# Altium project adau1979-fpga.PrjPcb (part 1 of 6)
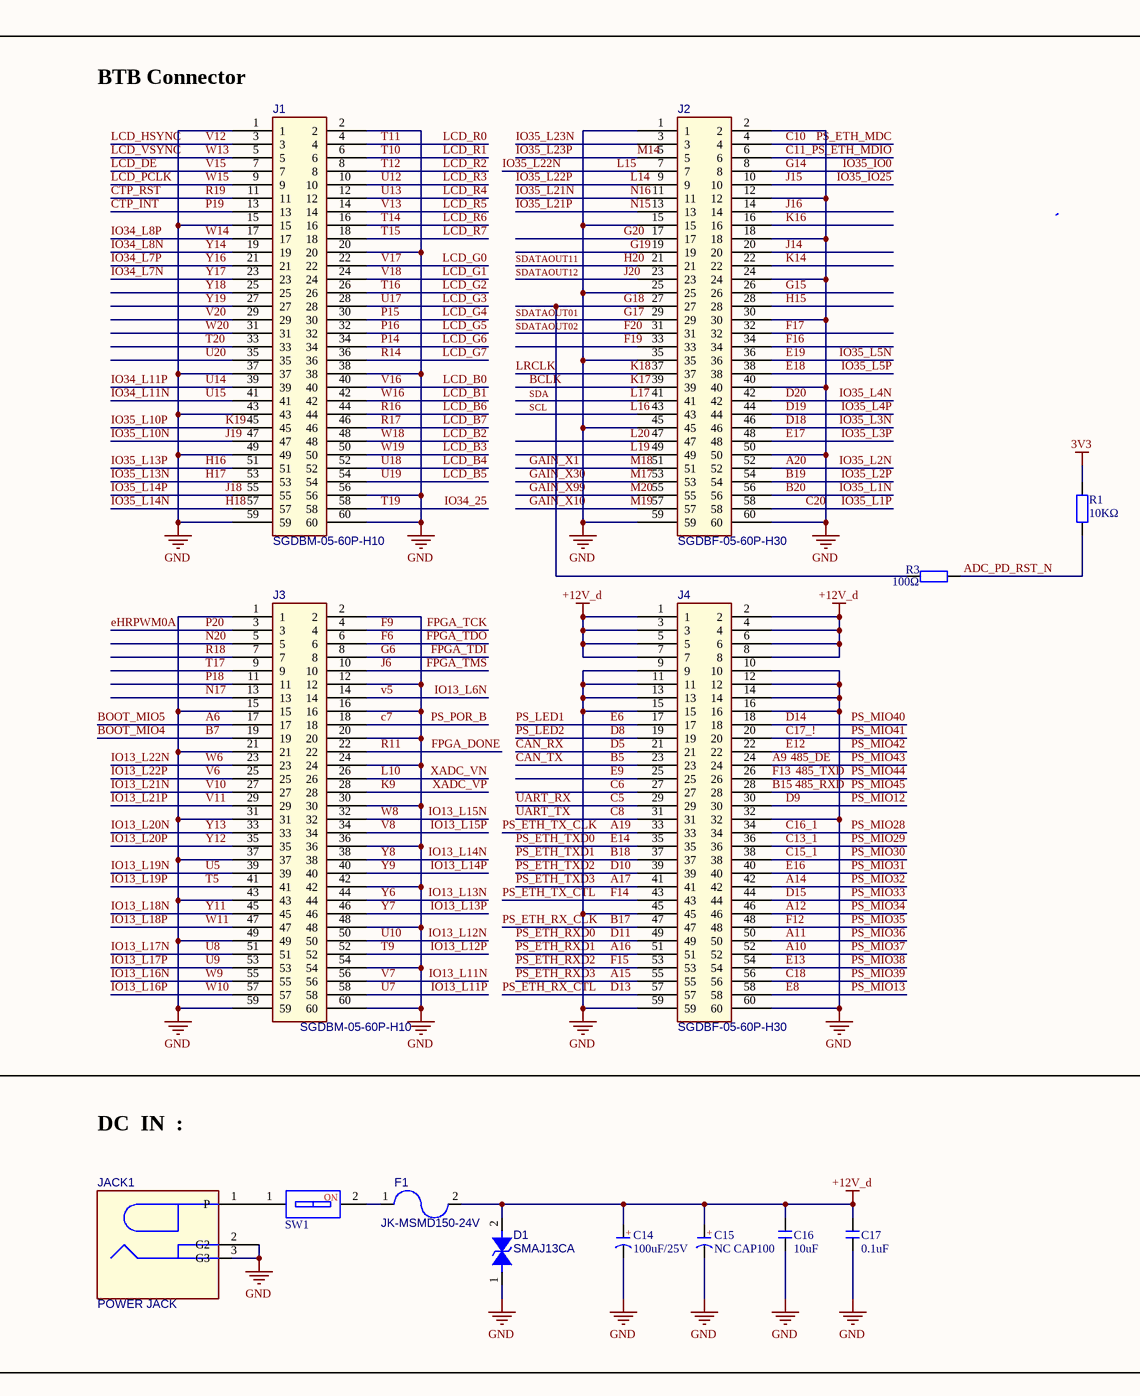
[diagram p0: adau1979_fpga.SchDoc, top left]
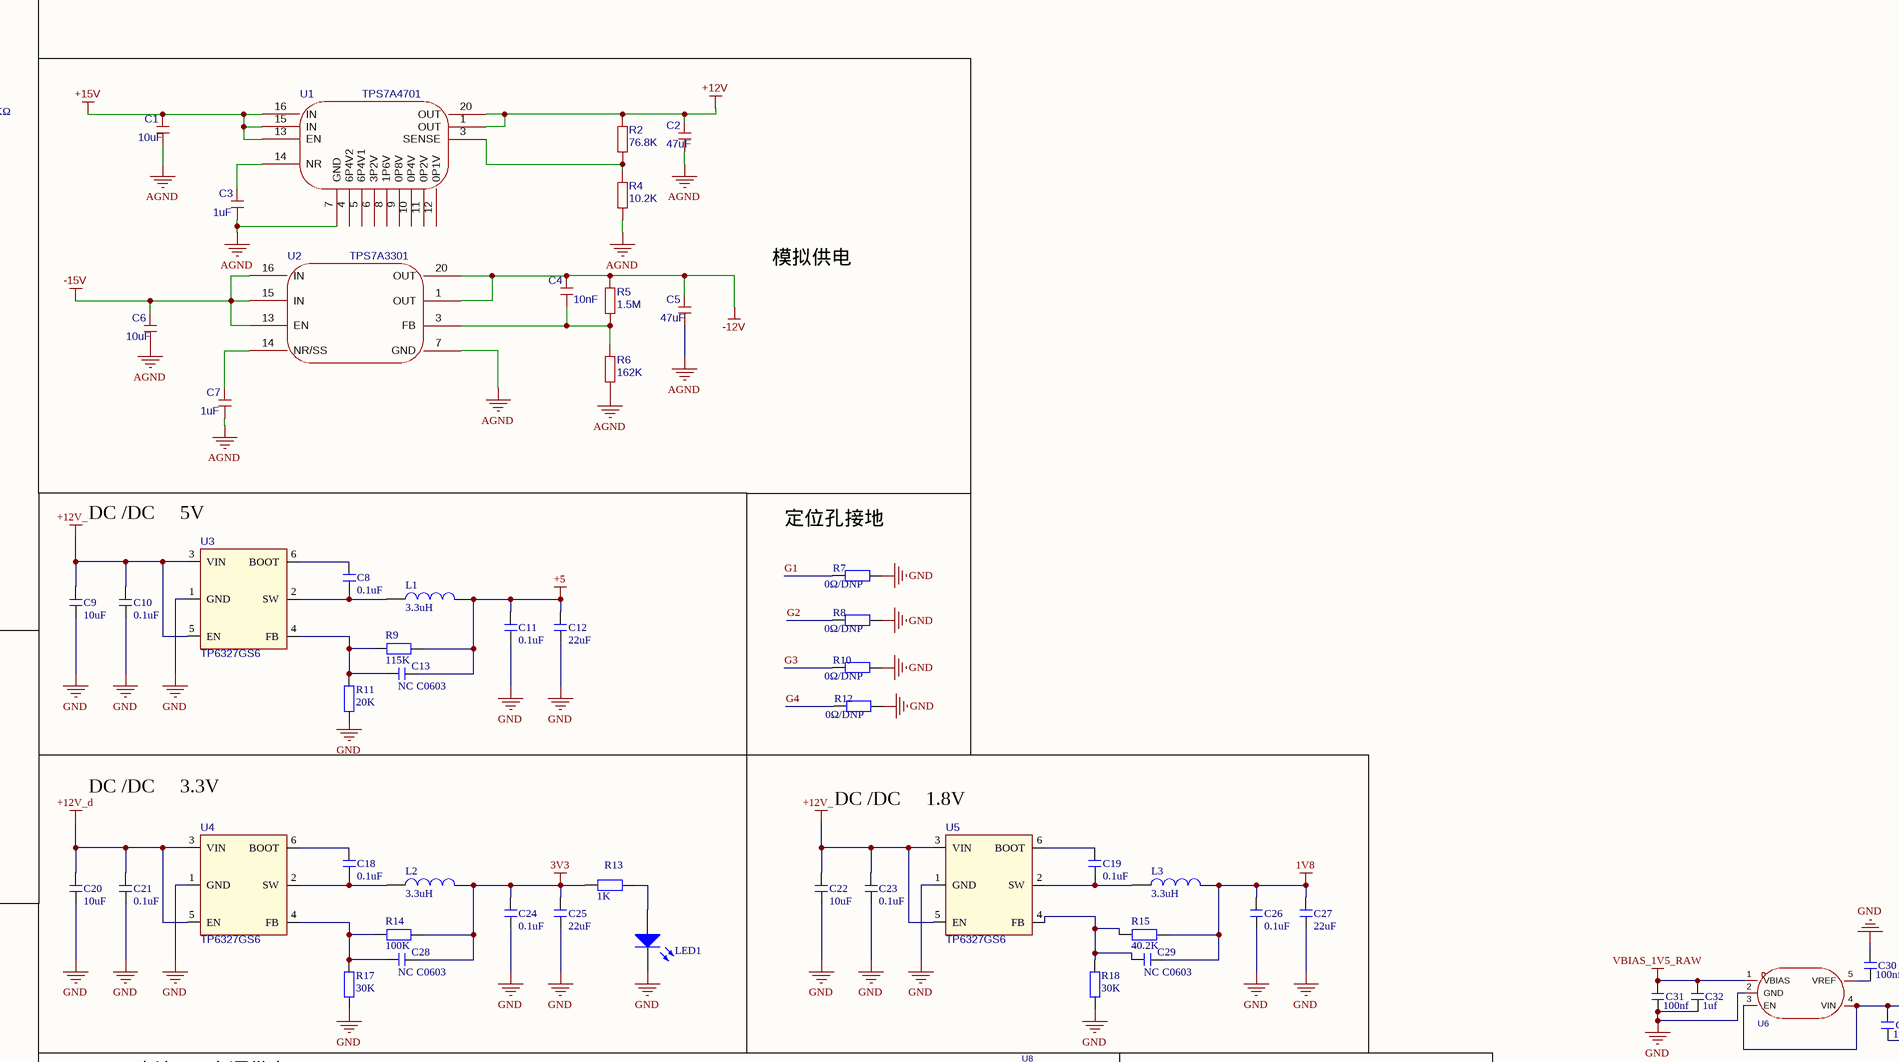
[diagram p1: adau1979_fpga.SchDoc, top middle]
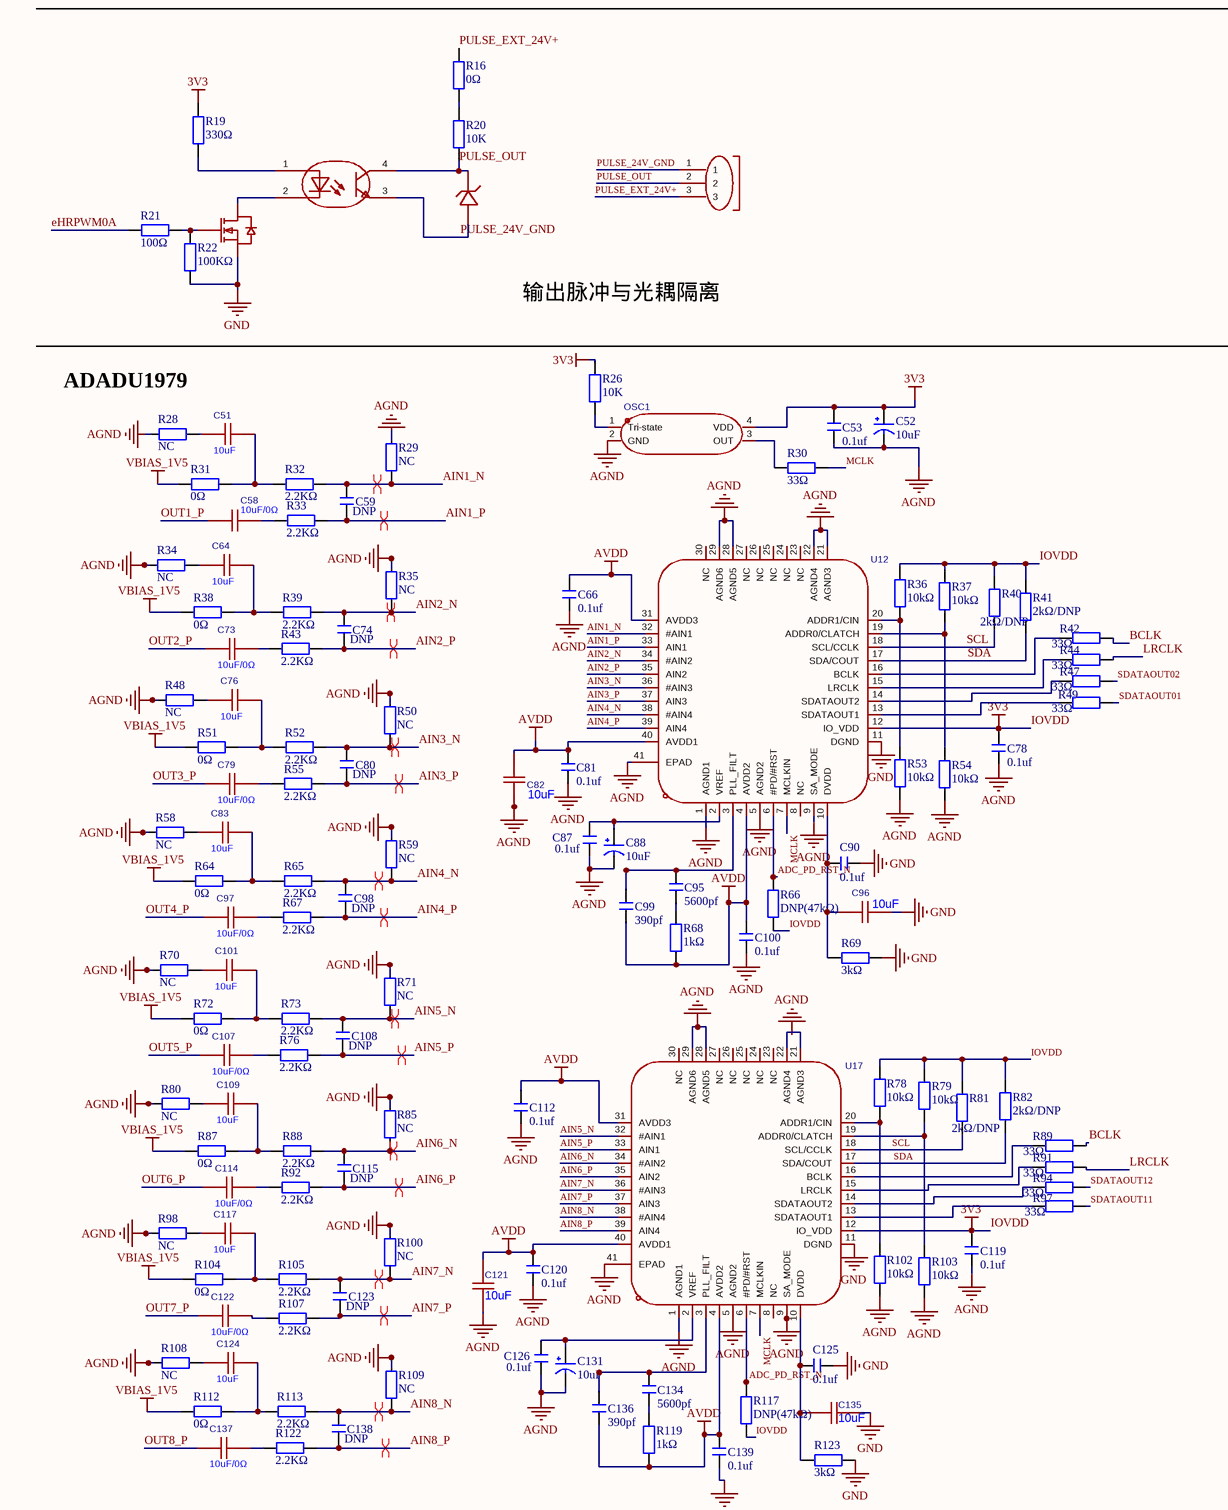
[diagram p2: adau1979_fpga.SchDoc, centre left]
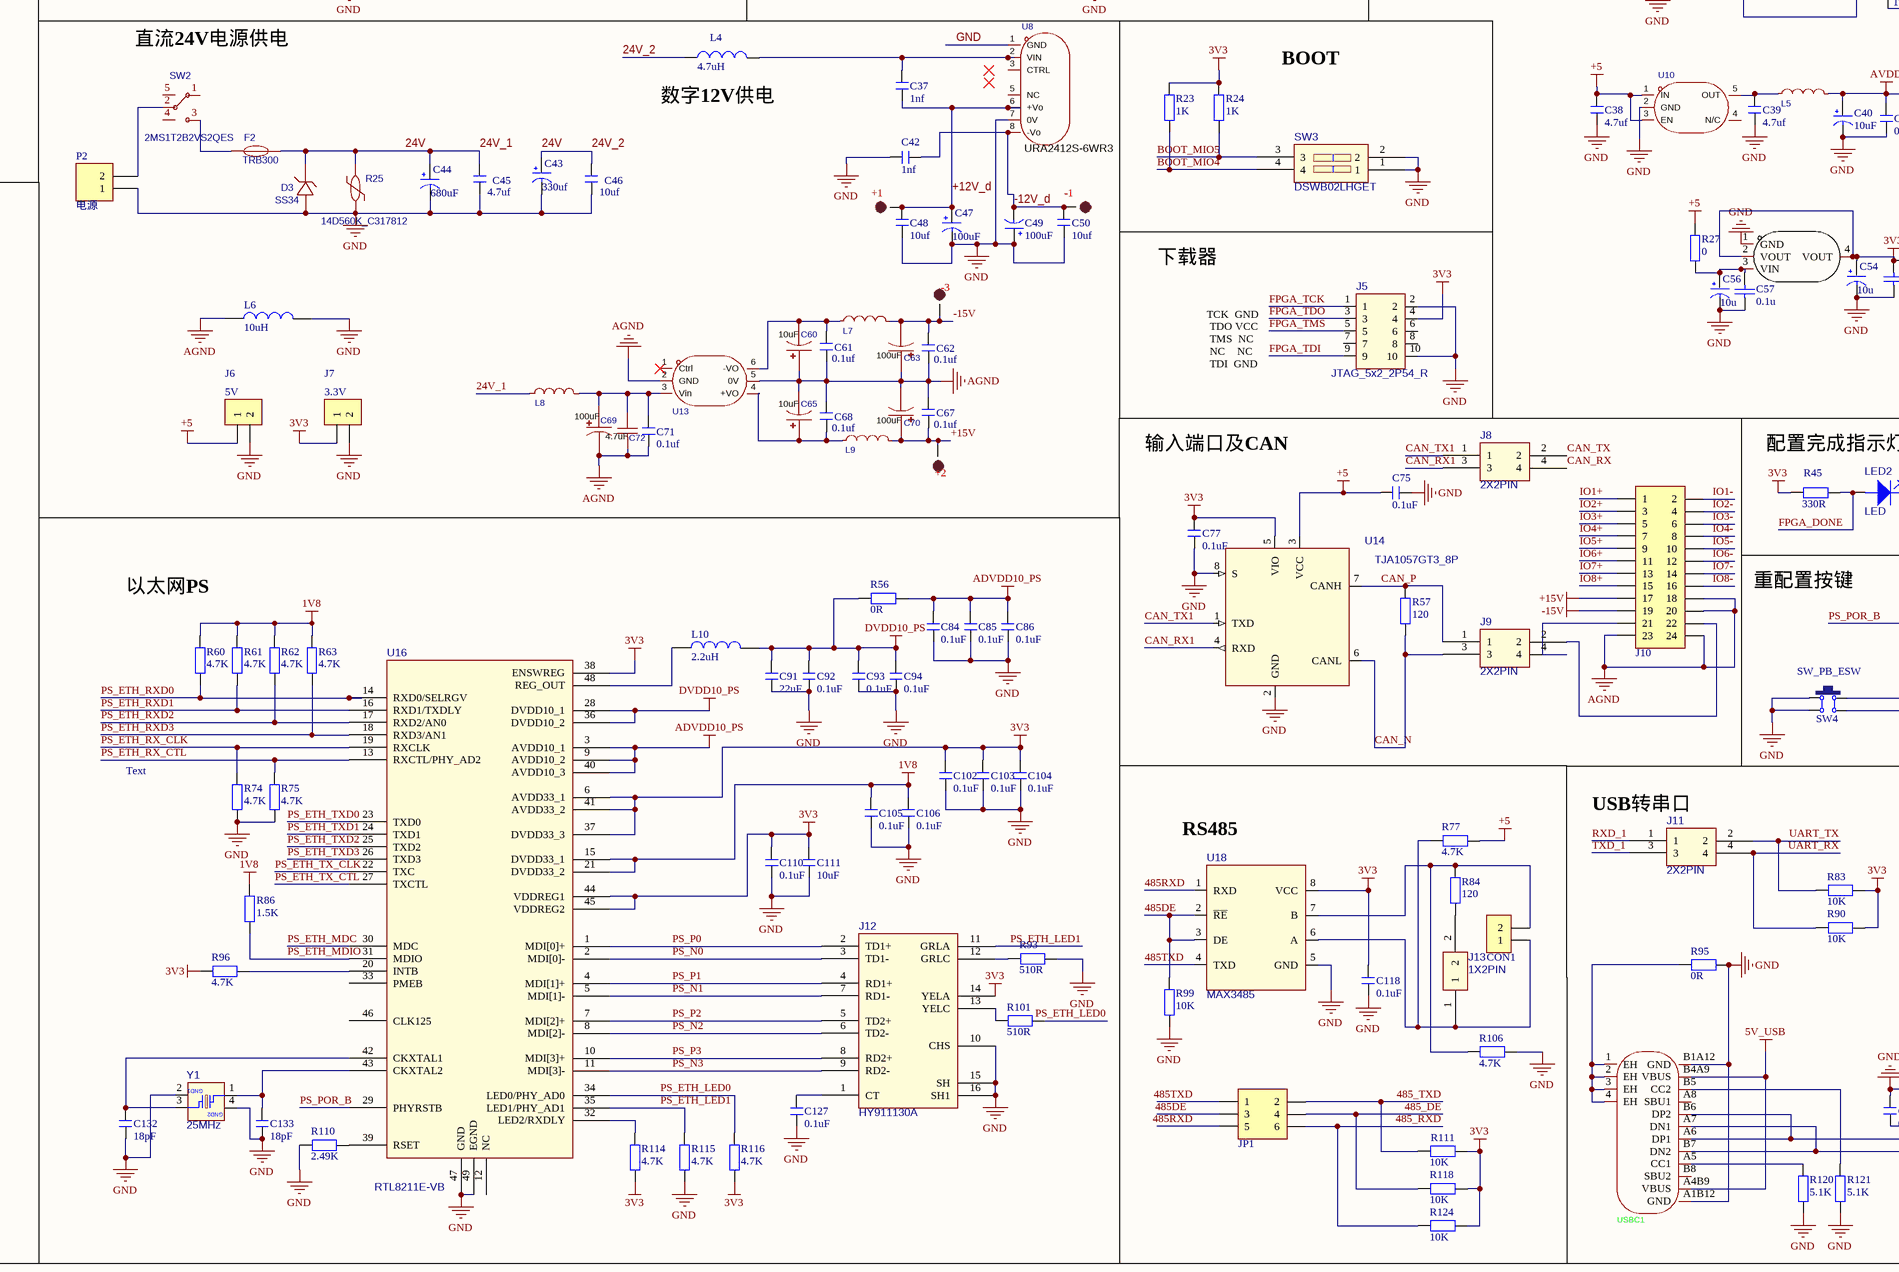
[diagram p3: adau1979_fpga.SchDoc, centre middle]
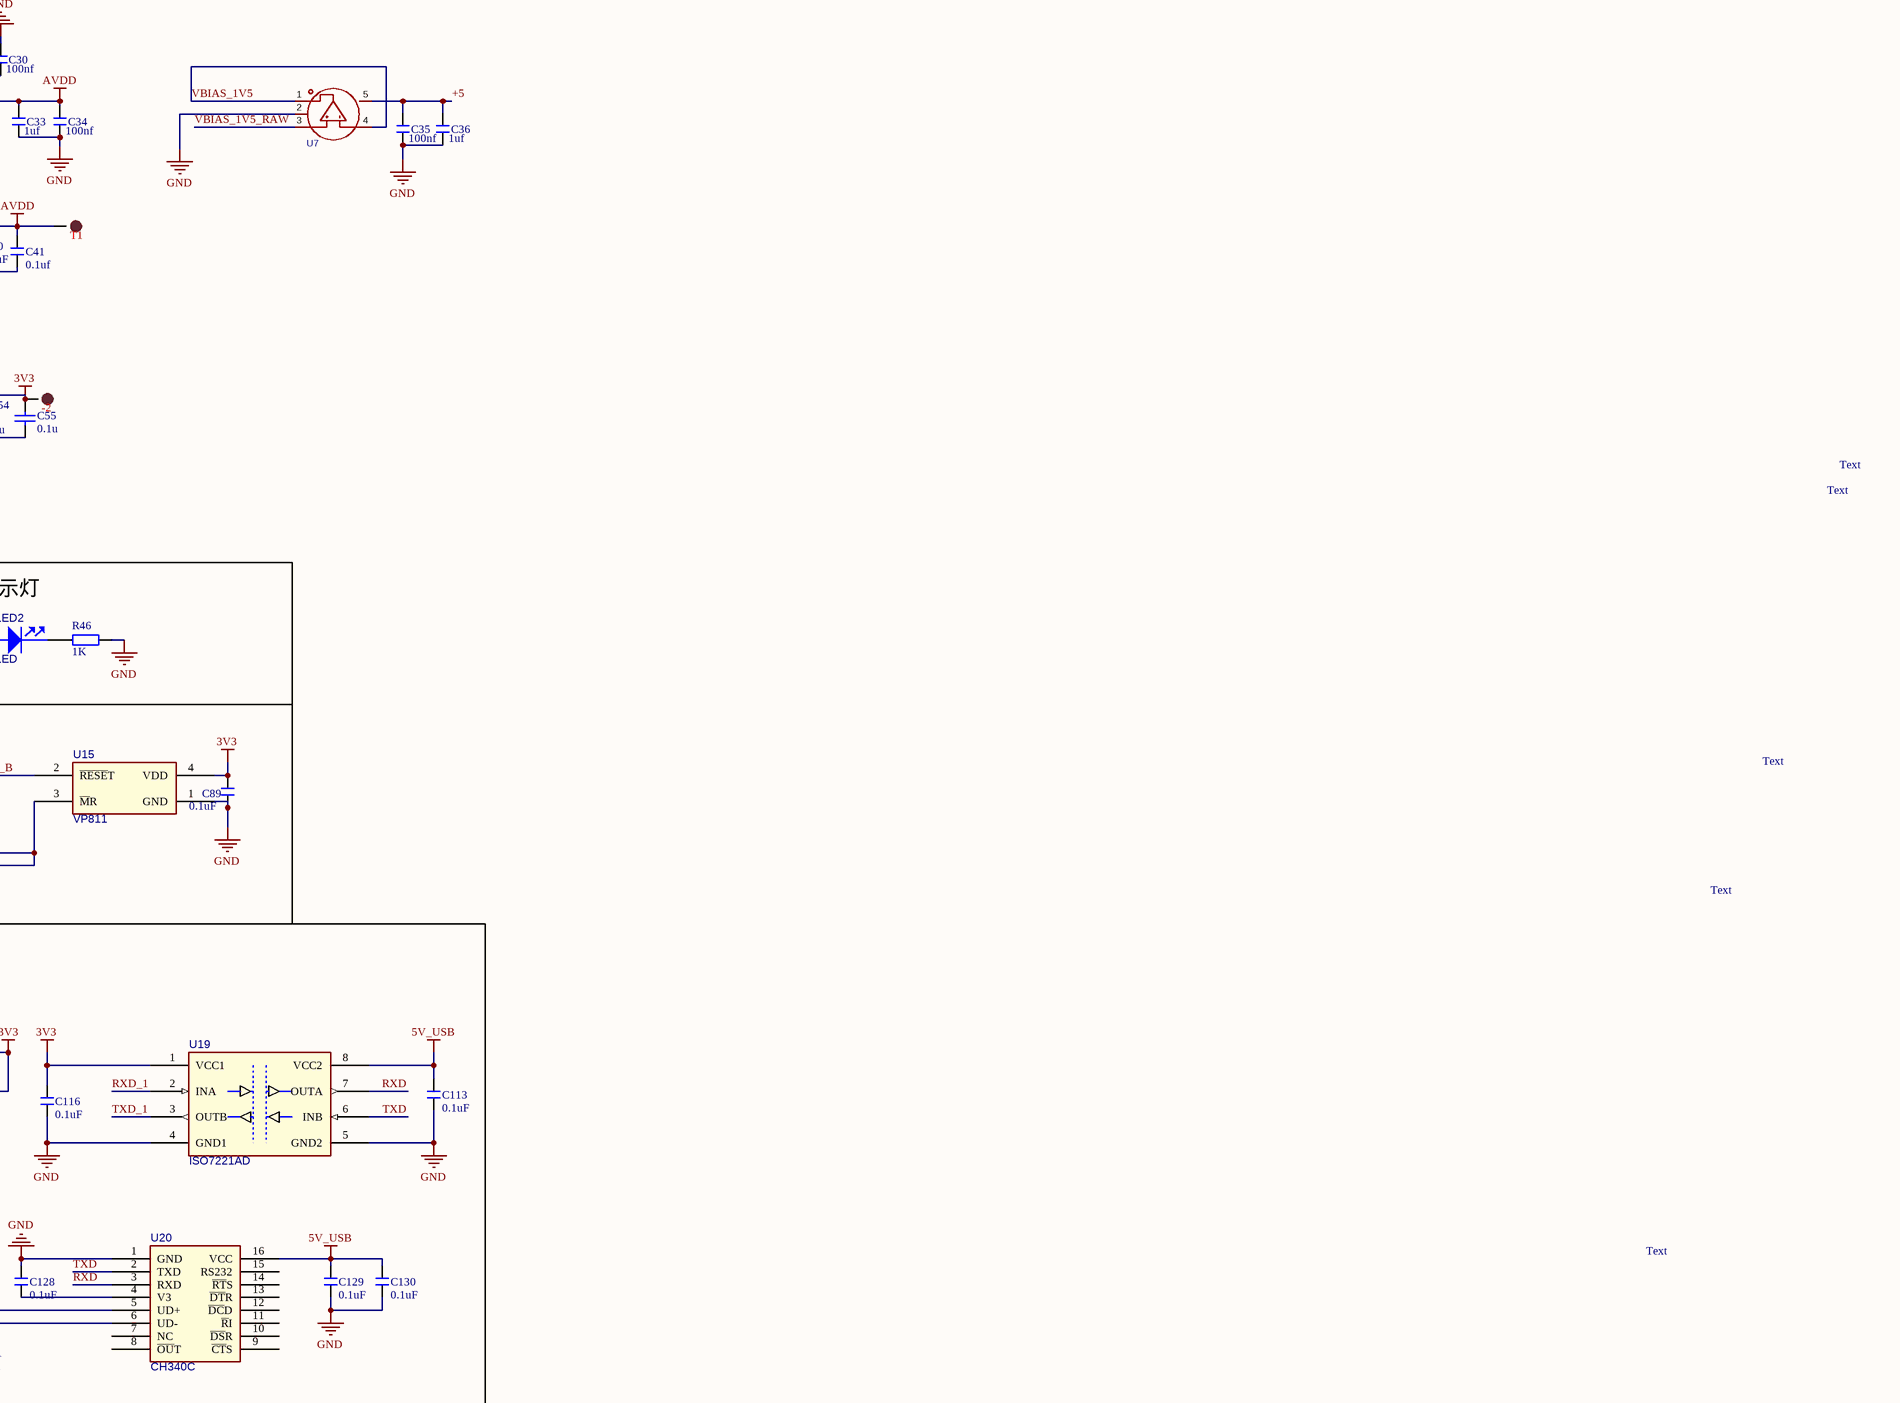
[diagram p4: adau1979_fpga.SchDoc, centre right]
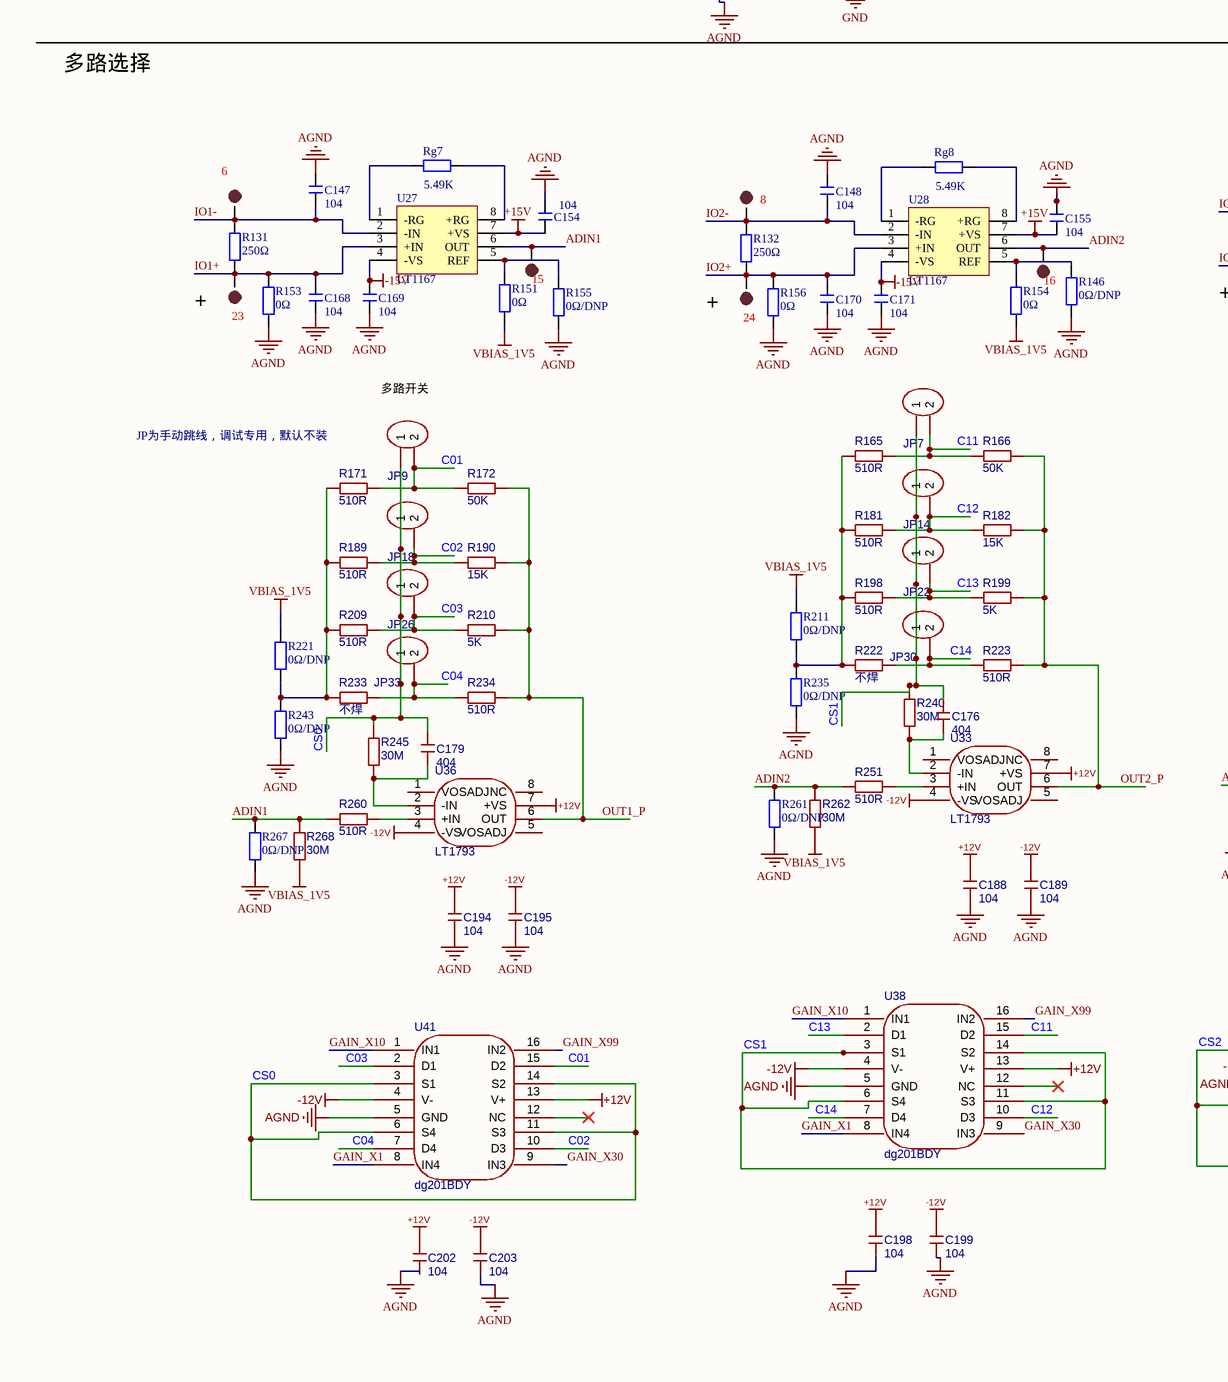
[diagram p5: adau1979_fpga.SchDoc, bottom left]
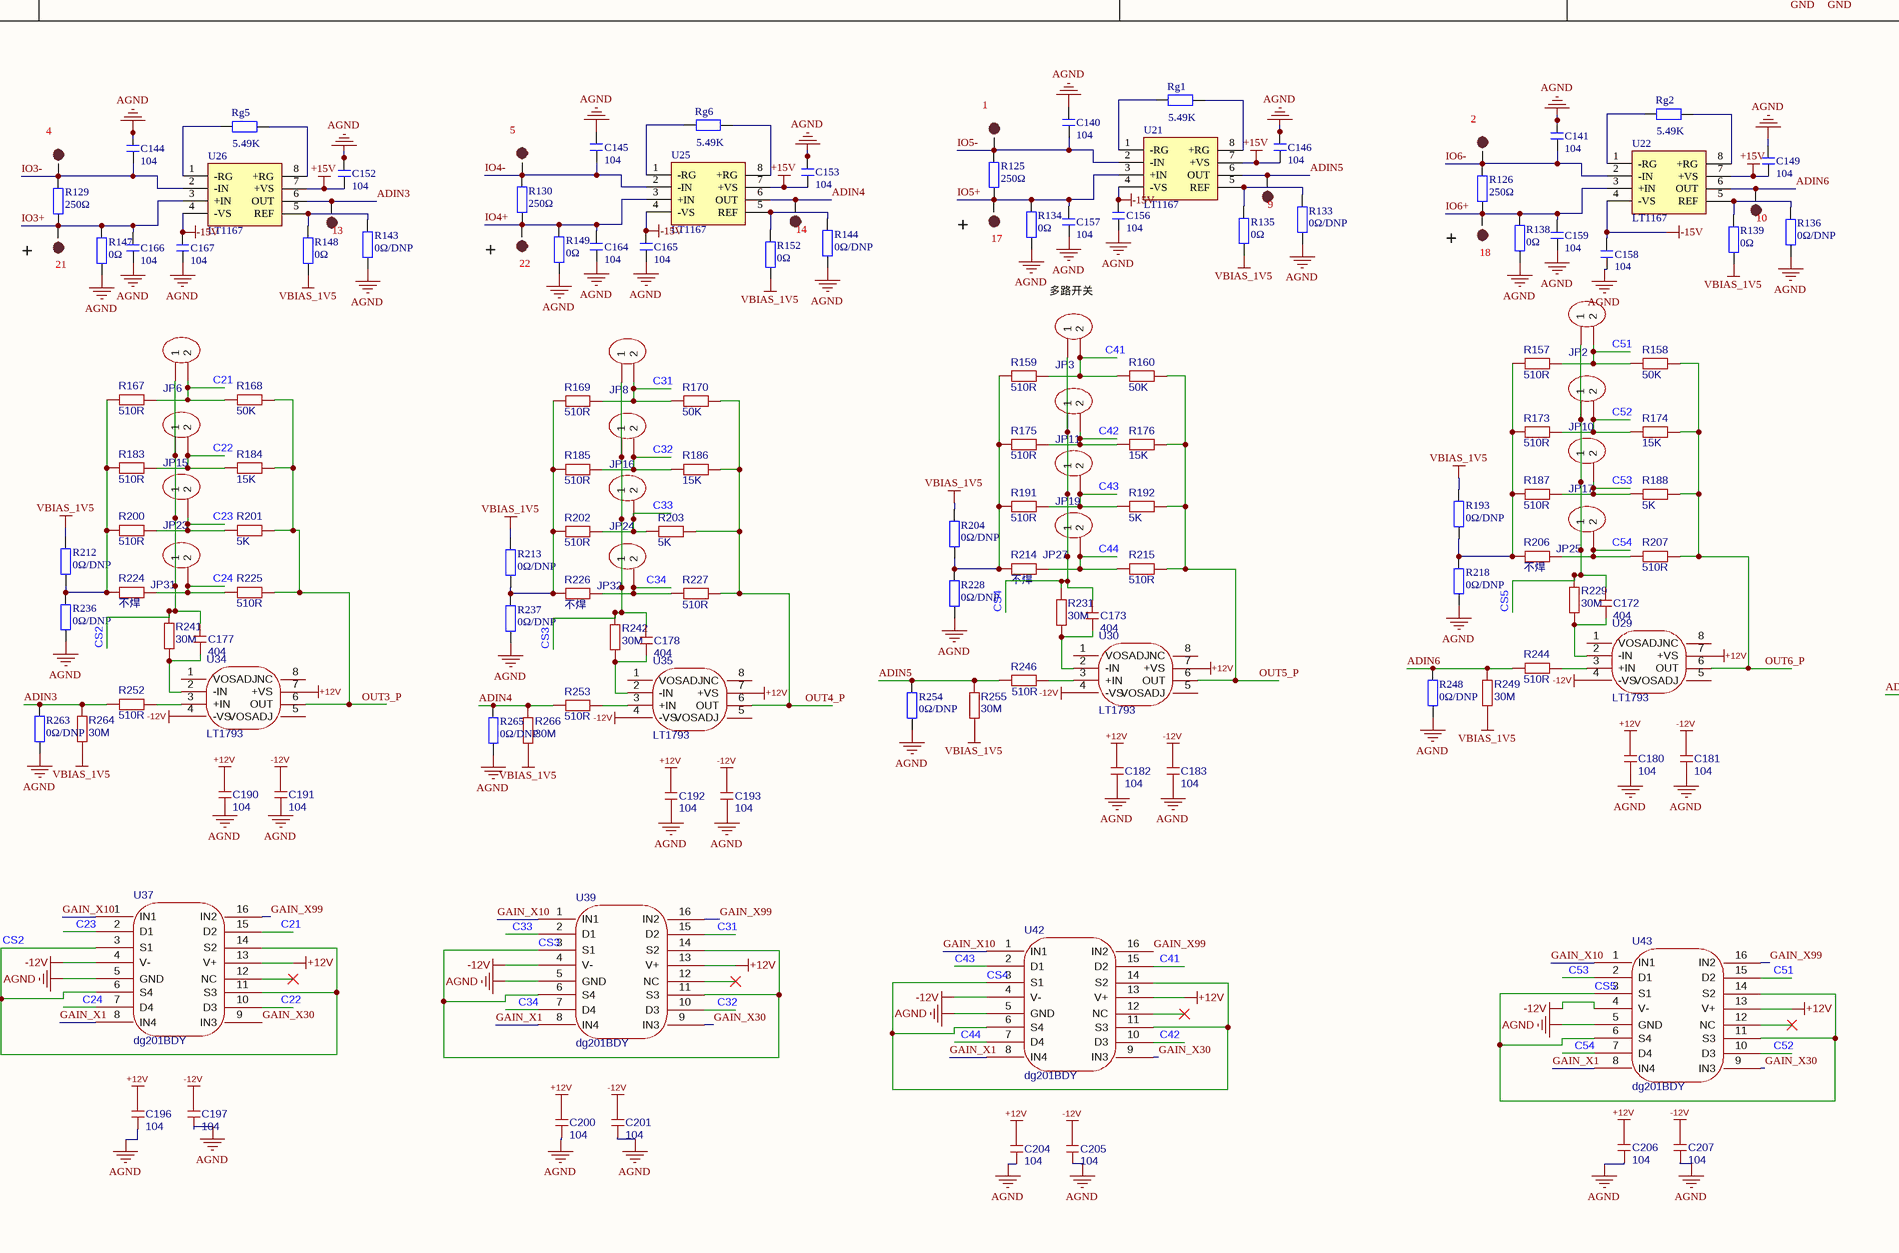
[diagram p6: adau1979_fpga.SchDoc, bottom middle]
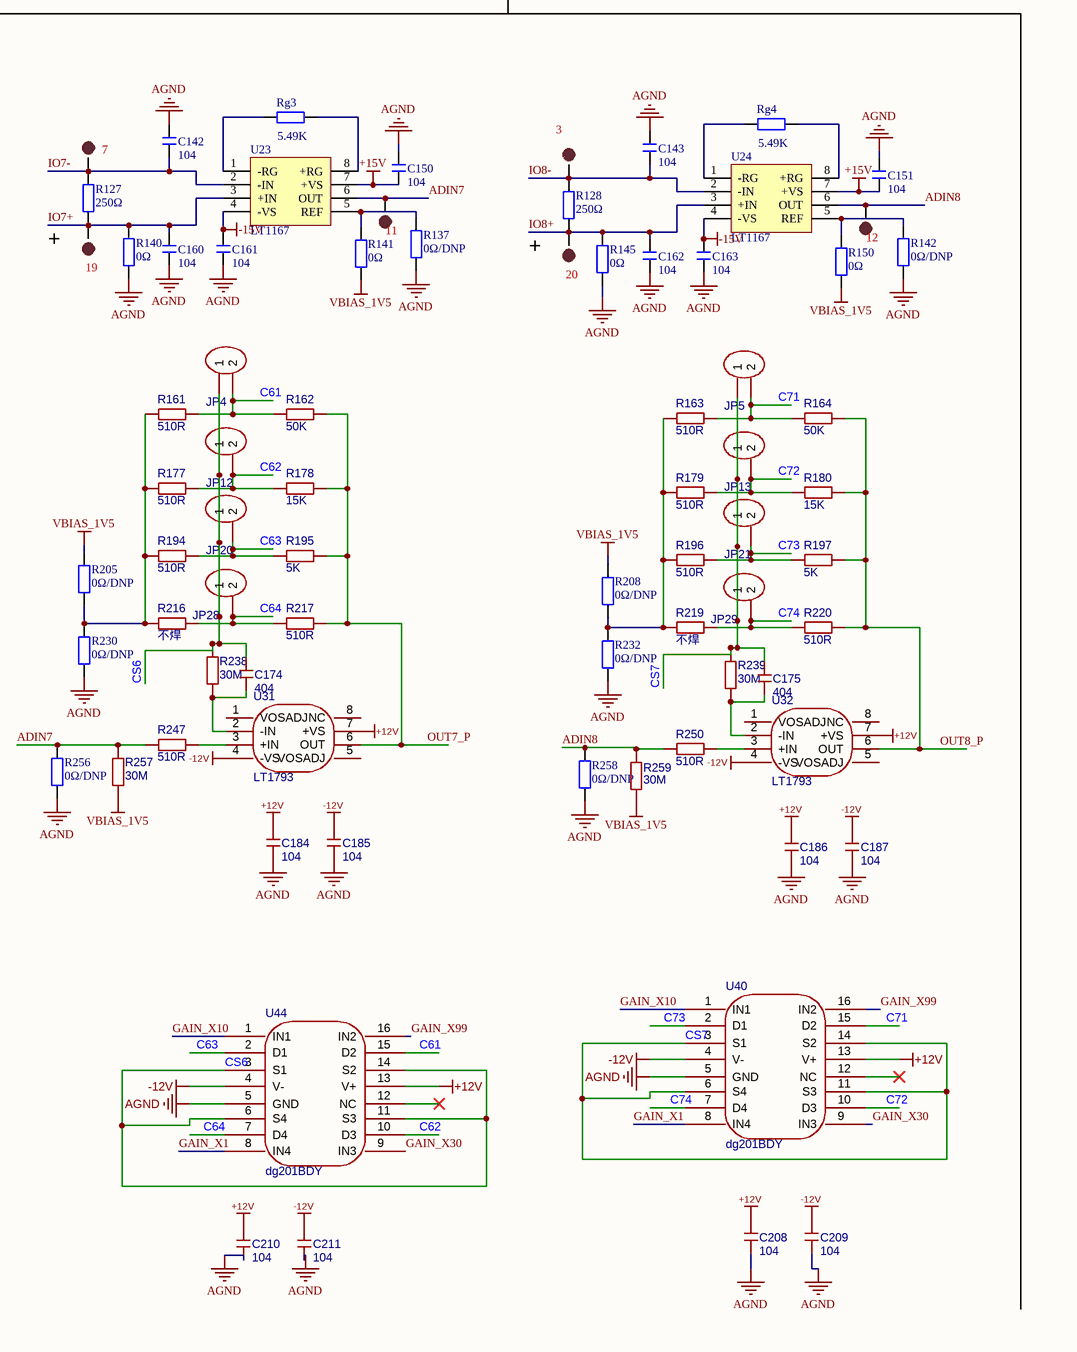
[diagram p7: adau1979_fpga.SchDoc, bottom right]
1 sheet, 636 parts. Net scope: global (net labels, ports and power ports of the same name join across sheets).
Board file: adau1979-fpga.PcbDoc

## Sheet adau1979_fpga.SchDoc
size A0; SheetNumber: 1; SheetTotal: 1

### Parts
1  TEST POINT  [TEST]  (value not drawn)
2  TEST POINT  [TEST]  (value not drawn)
3  TEST POINT  [TEST]  (value not drawn)
4  TEST POINT  [TEST]  (value not drawn)
5  TEST POINT  [TEST]  (value not drawn)
6  TEST POINT  [TEST]  (value not drawn)
7  TEST POINT  [TEST]  (value not drawn)
8  TEST POINT  [TEST]  (value not drawn)
9  TEST POINT  [TEST]  (value not drawn)
10  TEST POINT  [TEST]  (value not drawn)
11  TEST POINT  [TEST]  (value not drawn)
12  TEST POINT  [TEST]  (value not drawn)
13  TEST POINT  [TEST]  (value not drawn)
14  TEST POINT  [TEST]  (value not drawn)
15  TEST POINT  [TEST]  (value not drawn)
16  TEST POINT  [TEST]  (value not drawn)
17  TEST POINT  [TEST]  (value not drawn)
18  TEST POINT  [TEST]  (value not drawn)
19  TEST POINT  [TEST]  (value not drawn)
20  TEST POINT  [TEST]  (value not drawn)
21  TEST POINT  [TEST]  (value not drawn)
22  TEST POINT  [TEST]  (value not drawn)
23  TEST POINT  [TEST]  (value not drawn)
24  TEST POINT  [TEST]  (value not drawn)
+1  TEST POINT  [TEST]  (value not drawn)
+2  TEST POINT  [TEST]  (value not drawn)
-1  TEST POINT  [TEST]  (value not drawn)
-2  TEST POINT  [TEST]  (value not drawn)
-3  TEST POINT  [TEST]  (value not drawn)
C1  10uF  [C 0603_L]
C2  47uF  [C 0603_L]
C3  1uF  [C 0603_L]
C4  10nF  [C 0603_L]
C5  47uF  [C 0603_L]
C6  10uF  [C 0603_L]
C7  1uF  [C 0603_L]
C8  0.1uF  [0603]
C9  10uF  [0603]
C10  0.1uF  [0603]
C11  0.1uF  [0603]
C12  22uF  [0603]
C13  NC C0603  [0603]
C14  100uF/25V  [CM D(6.3*5.4)]
C15  NC CAP100  [CM D(6.3*5.4)]
C16  10uF  [C 0805_L]
C17  0.1uF  [C 0805_L]
C18  0.1uF  [0603]
C19  0.1uF  [0603]
C20  10uF  [0603]
C21  0.1uF  [0603]
C22  10uF  [0603]
C23  0.1uF  [0603]
C24  0.1uF  [0603]
C25  22uF  [0603]
C26  0.1uF  [0603]
C27  22uF  [0603]
C28  NC C0603  [0603]
C29  NC C0603  [0603]
C30  100nf  [0603C]
C31  100nf  [0603C]
C32  1uf  [0603C]
C33  1uf  [0603C]
C34  100nf  [0603C]
C35  100nf  [0603C]
C36  1uf  [0603C]
C37  1nf  [0603C]
C38  4.7uf  [0603C]
C39  4.7uf  [0603C]
C40  10uF  [5x11mm]
C41  0.1uf  [0603C]
C42  1nf  [0603C]
C43  330uf  [CAP-TH_BD10.0-P5.00-D1.0-FD]
C44  680uF  [CAP-TH_BD13.0-P5.00-D1.2-FD]
C45  4.7uf  [0603C]
C46  10uf  [0603C]
C47  100uF  [CAP-TH_BD8.0-P3.50-D0.6-FD]
C48  10uf  [0603C]
C49  100uF  [CAP-TH_BD8.0-P3.50-D0.6-FD]
C50  10uf  [0603C]
C51  10uF  [C1210]
C52  10uF  [5x11mm]
C53  0.1uf  [0603C]
C54  10u  [5x11mm]
C55  0.1u  [0603C]
C56  10u  [5x11mm]
C57  0.1u  [0603C]
C58  10uF/0Ω  [C1210]
C59  DNP  [0603C]
C60  10uF  [CAP-TH_BD6.3-P2.50-D0.6-FD]
C61  0.1uf  [0603C]
C62  0.1uf  [0603C]
C63  100uF  [CAP-TH_BD8.0-P3.50-D0.6-FD_1]
C64  10uF  [C1210]
C65  10uF  [CAP-TH_BD6.3-P2.50-D0.6-FD]
C66  0.1uf  [0603C]
C67  0.1uf  [0603C]
C68  0.1uf  [0603C]
C69  100uF  [CAP-TH_BD8.0-P3.50-D0.6-FD_1]
C70  100uF  [CAP-TH_BD8.0-P3.50-D0.6-FD_1]
C71  0.1uf  [0603C]
C72  4.7uF  [C1206]
C73  10uF/0Ω  [C1210]
C74  DNP  [0603C]
C75  0.1uF  [0603]
C76  10uF  [C1210]
C77  0.1uF  [0603]
C78  0.1uf  [0603C]
C79  10uF/0Ω  [C1210]
C80  DNP  [0603C]
C81  0.1uf  [0603C]
C82  10uF  [C1206]
C83  10uF  [C1210]
C84  0.1uF  [0603]
C85  0.1uF  [0603]
C86  0.1uF  [0603]
C87  0.1uf  [0603C]
C88  10uF  [5x11mm]
C89  0.1uF  [0603]
C90  0.1uf  [0603C]
C91  22uF  [0603]
C92  0.1uF  [0603]
C93  0.1uF  [0603]
C94  0.1uF  [0603]
C95  5600pf  [0603C]
C96  10uF  [C1206]
C97  10uF/0Ω  [C1210]
C98  DNP  [0603C]
C99  390pf  [0603C]
C100  0.1uf  [0603C]
C101  10uF  [C1210]
C102  0.1uF  [0603]
C103  0.1uF  [0603]
C104  0.1uF  [0603]
C105  0.1uF  [0603]
C106  0.1uF  [0603]
C107  10uF/0Ω  [C1210]
C108  DNP  [0603C]
C109  10uF  [C1210]
C110  0.1uF  [0603]
C111  10uF  [0603]
C112  0.1uf  [0603C]
C113  0.1uF  [0603]
C114  10uF/0Ω  [C1210]
C115  DNP  [0603C]
C116  0.1uF  [0603]
C117  10uF  [C1210]
C118  0.1uF  [0603]
C119  0.1uf  [0603C]
C120  0.1uf  [0603C]
C121  10uF  [C1206]
C122  10uF/0Ω  [C1210]
C123  DNP  [0603C]
C124  10uF  [C1210]
C125  0.1uf  [0603C]
C126  0.1uf  [0603C]
C127  0.1uF  [0603]
C128  0.1uF  [0603]
C129  0.1uF  [0603]
C130  0.1uF  [0603]
C131  10uF  [5x11mm]
C132  18pF  [0603]
C133  18pF  [0603]
C134  5600pf  [0603C]
C135  10uF  [C1206]
C136  390pf  [0603C]
C137  10uF/0Ω  [C1210]
C138  DNP  [0603C]
C139  0.1uf  [0603C]
C140  104  [0603C]
C141  104  [0603C]
C142  104  [0603C]
C143  104  [0603C]
C144  104  [0603C]
C145  104  [0603C]
C146  104  [0603C]
C147  104  [0603C]
C148  104  [0603C]
C149  104  [0603C]
C150  104  [0603C]
C151  104  [0603C]
C152  104  [0603C]
C153  104  [0603C]
C154  104  [0603C]
C155  104  [0603C]
C156  104  [0603C]
C157  104  [0603C]
C158  104  [0603C]
C159  104  [0603C]
C160  104  [0603C]
C161  104  [0603C]
C162  104  [0603C]
C163  104  [0603C]
C164  104  [0603C]
C165  104  [0603C]
C166  104  [0603C]
C167  104  [0603C]
C168  104  [0603C]
C169  104  [0603C]
C170  104  [0603C]
C171  104  [0603C]
C172  404  [C 0603_L]
C173  404  [C 0603_L]
C174  404  [C 0603_L]
C175  404  [C 0603_L]
C176  404  [C 0603_L]
C177  404  [C 0603_L]
C178  404  [C 0603_L]
C179  404  [C 0603_L]
C180  104  [C 0603_L]
C181  104  [C 0603_L]
C182  104  [C 0603_L]
C183  104  [C 0603_L]
C184  104  [C 0603_L]
C185  104  [C 0603_L]
C186  104  [C 0603_L]
C187  104  [C 0603_L]
C188  104  [C 0603_L]
C189  104  [C 0603_L]
C190  104  [C 0603_L]
C191  104  [C 0603_L]
C192  104  [C 0603_L]
C193  104  [C 0603_L]
C194  104  [C 0603_L]
C195  104  [C 0603_L]
C196  104  [C 0603_L]
C197  104  [C 0603_L]
C198  104  [C 0603_L]
C199  104  [C 0603_L]
C200  104  [C 0603_L]
C201  104  [C 0603_L]
C202  104  [C 0603_L]
C203  104  [C 0603_L]
C204  104  [C 0603_L]
C205  104  [C 0603_L]
C206  104  [C 0603_L]
C207  104  [C 0603_L]
C208  104  [C 0603_L]
C209  104  [C 0603_L]
C210  104  [C 0603_L]
C211  104  [C 0603_L]
CON1  HDR-1X2  [KF128-5.08-2P]  (value not drawn)
D1  SMAJ13CA  [SMA]
D2  smbj33a_c224019  [SMB_L4.6-W3.6-LS5.3-RD]  (value not drawn)
D3  SS34  [SMA_L4.4-W2.8-LS5.4-RD]
F1  JK-MSMD150-24V  [1812]
F2  TRB300  [FUSE-TH_L13.0-W3.1-P5.10-D0.8-S1.40]
J1  SGDBM-05-60P-H10  [CONN-SMD_60P-P0.50_SGDBM-05-60P_1]
J2  SGDBF-05-60P-H30  [CONN-SMD_60P-P0.50_SGDBF-05-60P_1]
J3  SGDBM-05-60P-H10  [CONN-SMD_60P-P0.50_SGDBM-05-60P_1]
J4  SGDBF-05-60P-H30  [CONN-SMD_60P-P0.50_SGDBF-05-60P_1]
J5  JTAG_5x2_2P54_R  [HDR2.54-LI-2x5P]
J6  5V  [2pin]
J7  3.3V  [2pin]
J8  2X2PIN  [HDR2X2_B]
J9  2X2PIN  [HDR2X2_B]
J10  Header 2X11  [IDC2.54-LI-2x12P]  (value not drawn)
J11  2X2PIN  [HDR2X2_B]
J12  HY911130A  [RJ45-TH_10P-P2.54-S2.54_L16.1-W21.4_HY911130A]
J13  1X2PIN  [HDR2.54-Y-LI-2P]
JACK1  POWER JACK  [DC-005]
JP1  Header3X2  [HDR2.54-LI-2x3P]  (value not drawn)
JP2  HDR-1X2  [HDR2.54-Y-LI-2P]  (value not drawn)
JP3  HDR-1X2  [HDR2.54-Y-LI-2P]  (value not drawn)
JP4  HDR-1X2  [HDR2.54-Y-LI-2P]  (value not drawn)
JP5  HDR-1X2  [HDR2.54-Y-LI-2P]  (value not drawn)
JP6  HDR-1X2  [HDR2.54-Y-LI-2P]  (value not drawn)
JP7  HDR-1X2  [HDR2.54-Y-LI-2P]  (value not drawn)
JP8  HDR-1X2  [HDR2.54-Y-LI-2P]  (value not drawn)
JP9  HDR-1X2  [HDR2.54-Y-LI-2P]  (value not drawn)
JP10  HDR-1X2  [HDR2.54-Y-LI-2P]  (value not drawn)
JP11  HDR-1X2  [HDR2.54-Y-LI-2P]  (value not drawn)
JP12  HDR-1X2  [HDR2.54-Y-LI-2P]  (value not drawn)
JP13  HDR-1X2  [HDR2.54-Y-LI-2P]  (value not drawn)
JP14  HDR-1X2  [HDR2.54-Y-LI-2P]  (value not drawn)
JP15  HDR-1X2  [HDR2.54-Y-LI-2P]  (value not drawn)
JP16  HDR-1X2  [HDR2.54-Y-LI-2P]  (value not drawn)
JP17  HDR-1X2  [HDR2.54-Y-LI-2P]  (value not drawn)
JP18  HDR-1X2  [HDR2.54-Y-LI-2P]  (value not drawn)
JP19  HDR-1X2  [HDR2.54-Y-LI-2P]  (value not drawn)
JP20  HDR-1X2  [HDR2.54-Y-LI-2P]  (value not drawn)
JP21  HDR-1X2  [HDR2.54-Y-LI-2P]  (value not drawn)
JP22  HDR-1X2  [HDR2.54-Y-LI-2P]  (value not drawn)
JP23  HDR-1X2  [HDR2.54-Y-LI-2P]  (value not drawn)
JP24  HDR-1X2  [HDR2.54-Y-LI-2P]  (value not drawn)
JP25  HDR-1X2  [HDR2.54-Y-LI-2P]  (value not drawn)
JP26  HDR-1X2  [HDR2.54-Y-LI-2P]  (value not drawn)
JP27  HDR-1X2  [HDR2.54-Y-LI-2P]  (value not drawn)
JP28  HDR-1X2  [HDR2.54-Y-LI-2P]  (value not drawn)
JP29  HDR-1X2  [HDR2.54-Y-LI-2P]  (value not drawn)
JP30  HDR-1X2  [HDR2.54-Y-LI-2P]  (value not drawn)
JP31  HDR-1X2  [HDR2.54-Y-LI-2P]  (value not drawn)
JP32  HDR-1X2  [HDR2.54-Y-LI-2P]  (value not drawn)
JP33  HDR-1X2  [HDR2.54-Y-LI-2P]  (value not drawn)
L1  3.3uH  [L 0805]
L2  3.3uH  [L 0805]
L3  3.3uH  [L 0805]
L4  4.7uH  [1210L]
L5  mpz1608s221ata00  [L0603]  (value not drawn)
L6  10uH  [L 0603]
L7  blm31pg121sn1l  [L1206]  (value not drawn)
L8  srn6045ta-4r7m  [IND-SMD_L6.0-W6.0]  (value not drawn)
L9  blm31pg121sn1l  [L1206]  (value not drawn)
L10  2.2uH  [L 0805]
LED1  LED  [0603]  (value not drawn)
LED2  LED  [LED 0805R]
OSC1  ot2el4c4ji-111olp-24.576m  [OSC-SMD_4P-L3.2-W2.5-BL]  (value not drawn)
P1  wj500v-5.08-03p-14-00a  [CONN-TH_3P-P5.00_WJ500V-5.08-3P]  (value not drawn)
P2  电源  [CONN-TH_2P-P5.08]
Q1  2n7002,215  [SOT-23_L2.9-W1.3-P1.90-LS2.4-BR]  (value not drawn)
R1  10KΩ  [0603R]
R2  76.8K  [R 0603_L]
R3  100Ω  [0603R]
R4  10.2K  [R 0603_L]
R5  1.5M  [R 0603_L]
R6  162K  [R 0603_L]
R7  0Ω/DNP  [0603R]
R8  0Ω/DNP  [0603R]
R9  115K  [0603]
R10  0Ω/DNP  [0603R]
R11  20K  [0603]
R12  0Ω/DNP  [0603R]
R13  1K  [0603]
R14  100K  [0603]
R15  40.2K  [0603]
R16  0Ω  [0603R]
R17  30K  [0603]
R18  30K  [0603]
R19  330Ω  [0603R]
R20  10K  [0603R]
R21  100Ω  [0603R]
R22  100KΩ  [0603R]
R23  1K  [0603]
R24  1K  [0603]
R25  14D560K_C317812  [RES-TH_L16.5-W3.5-P7.50-D0.8-S2.10]
R26  10K  [0603R]
R27  0  [0603R]
R28  NC  [0603R]
R29  NC  [0603R]
R30  33Ω  [0603R]
R31  0Ω  [0603R]
R32  2.2KΩ  [0603R]
R33  2.2KΩ  [0603R]
R34  NC  [0603R]
R35  NC  [0603R]
R36  10kΩ  [0603R]
R37  10kΩ  [0603R]
R38  0Ω  [0603R]
R39  2.2KΩ  [0603R]
R40  2kΩ/DNP  [0603R]
R41  2kΩ/DNP  [0603R]
R42  33Ω  [0603R]
R43  2.2KΩ  [0603R]
R44  33Ω  [0603R]
R45  330R  [0603]
R46  1K  [0603]
R47  33Ω  [0603R]
R48  NC  [0603R]
R49  33Ω  [0603R]
R50  NC  [0603R]
R51  0Ω  [0603R]
R52  2.2KΩ  [0603R]
R53  10kΩ  [0603R]
R54  10kΩ  [0603R]
R55  2.2KΩ  [0603R]
R56  0R  [0603]
R57  120  [0603]
R58  NC  [0603R]
R59  NC  [0603R]
R60  4.7K  [0603]
R61  4.7K  [0603]
R62  4.7K  [0603]
R63  4.7K  [0603]
R64  0Ω  [0603R]
R65  2.2KΩ  [0603R]
R66  DNP(47kΩ)  [0603R]
R67  2.2KΩ  [0603R]
R68  1kΩ  [0603R]
R69  3kΩ  [0603R]
R70  NC  [0603R]
R71  NC  [0603R]
R72  0Ω  [0603R]
R73  2.2KΩ  [0603R]
R74  4.7K  [0603]
R75  4.7K  [0603]
R76  2.2KΩ  [0603R]
R77  4.7K  [0603]
R78  10kΩ  [0603R]
R79  10kΩ  [0603R]
R80  NC  [0603R]
R81  2kΩ/DNP  [0603R]
R82  2kΩ/DNP  [0603R]
R83  10K  [0603]
R84  120  [0603]
R85  NC  [0603R]
R86  1.5K  [0603]
R87  0Ω  [0603R]
R88  2.2KΩ  [0603R]
R89  33Ω  [0603R]
R90  10K  [0603]
R91  33Ω  [0603R]
R92  2.2KΩ  [0603R]
R93  510R  [0603]
R94  33Ω  [0603R]
R95  0R  [0603]
R96  4.7K  [0603]
R97  33Ω  [0603R]
R98  NC  [0603R]
R99  10K  [0603]
R100  NC  [0603R]
R101  510R  [0603]
R102  10kΩ  [0603R]
R103  10kΩ  [0603R]
R104  0Ω  [0603R]
R105  2.2KΩ  [0603R]
R106  4.7K  [0603]
R107  2.2KΩ  [0603R]
R108  NC  [0603R]
R109  NC  [0603R]
R110  2.49K  [0603]
R111  10K  [0603]
R112  0Ω  [0603R]
R113  2.2KΩ  [0603R]
R114  4.7K  [0603]
R115  4.7K  [0603]
R116  4.7K  [0603]
R117  DNP(47kΩ)  [0603R]
R118  10K  [0603]
R119  1kΩ  [0603R]
R120  5.1K  [0603]
R121  5.1K  [0603]
R122  2.2KΩ  [0603R]
R123  3kΩ  [0603R]
R124  10K  [0603]
R125  250Ω  [0603R]
R126  250Ω  [0603R]
R127  250Ω  [0603R]
R128  250Ω  [0603R]
R129  250Ω  [0603R]
R130  250Ω  [0603R]
R131  250Ω  [0603R]
R132  250Ω  [0603R]
R133  0Ω/DNP  [0603R]
R134  0Ω  [0603R]
R135  0Ω  [0603R]
R136  0Ω/DNP  [0603R]
R137  0Ω/DNP  [0603R]
R138  0Ω  [0603R]
R139  0Ω  [0603R]
R140  0Ω  [0603R]
R141  0Ω  [0603R]
R142  0Ω/DNP  [0603R]
R143  0Ω/DNP  [0603R]
R144  0Ω/DNP  [0603R]
R145  0Ω  [0603R]
R146  0Ω/DNP  [0603R]
R147  0Ω  [0603R]
R148  0Ω  [0603R]
R149  0Ω  [0603R]
R150  0Ω  [0603R]
R151  0Ω  [0603R]
R152  0Ω  [0603R]
R153  0Ω  [0603R]
R154  0Ω  [0603R]
R155  0Ω/DNP  [0603R]
R156  0Ω  [0603R]
R157  510R  [0603R]
R158  50K  [0603R]
R159  510R  [0603R]
R160  50K  [0603R]
R161  510R  [0603R]
R162  50K  [0603R]
R163  510R  [0603R]
R164  50K  [0603R]
R165  510R  [0603R]
R166  50K  [0603R]
R167  510R  [0603R]
R168  50K  [0603R]
R169  510R  [0603R]
R170  50K  [0603R]
R171  510R  [0603R]
R172  50K  [0603R]
R173  510R  [0603R]
R174  15K  [0603R]
R175  510R  [0603R]
R176  15K  [0603R]
R177  510R  [0603R]
R178  15K  [0603R]
R179  510R  [0603R]
R180  15K  [0603R]
R181  510R  [0603R]
R182  15K  [0603R]
R183  510R  [0603R]
R184  15K  [0603R]
R185  510R  [0603R]
R186  15K  [0603R]
R187  510R  [0603R]
R188  5K  [0603R]
R189  510R  [0603R]
R190  15K  [0603R]
R191  510R  [0603R]
R192  5K  [0603R]
R193  0Ω/DNP  [0603R]
R194  510R  [0603R]
R195  5K  [0603R]
R196  510R  [0603R]
R197  5K  [0603R]
R198  510R  [0603R]
R199  5K  [0603R]
R200  510R  [0603R]
R201  5K  [0603R]
R202  510R  [0603R]
R203  5K  [0603R]
R204  0Ω/DNP  [0603R]
R205  0Ω/DNP  [0603R]
R206  不焊  [0603R]
R207  510R  [0603R]
R208  0Ω/DNP  [0603R]
R209  510R  [0603R]
R210  5K  [0603R]
R211  0Ω/DNP  [0603R]
R212  0Ω/DNP  [0603R]
R213  0Ω/DNP  [0603R]
R214  不焊  [0603R]
R215  510R  [0603R]
R216  不焊  [0603R]
R217  510R  [0603R]
R218  0Ω/DNP  [0603R]
R219  不焊  [0603R]
R220  510R  [0603R]
R221  0Ω/DNP  [0603R]
R222  不焊  [0603R]
R223  510R  [0603R]
R224  不焊  [0603R]
R225  510R  [0603R]
R226  不焊  [0603R]
R227  510R  [0603R]
R228  0Ω/DNP  [0603R]
R229  30M  [0603R]
R230  0Ω/DNP  [0603R]
R231  30M  [0603R]
R232  0Ω/DNP  [0603R]
R233  不焊  [0603R]
R234  510R  [0603R]
R235  0Ω/DNP  [0603R]
R236  0Ω/DNP  [0603R]
R237  0Ω/DNP  [0603R]
R238  30M  [0603R]
R239  30M  [0603R]
R240  30M  [0603R]
R241  30M  [0603R]
R242  30M  [0603R]
R243  0Ω/DNP  [0603R]
R244  510R  [0603R]
R245  30M  [0603R]
R246  510R  [0603R]
R247  510R  [0603R]
R248  0Ω/DNP  [0603R]
R249  30M  [0603R]
R250  510R  [0603R]
R251  510R  [0603R]
R252  510R  [0603R]
R253  510R  [0603R]
R254  0Ω/DNP  [0603R]
R255  30M  [0603R]
R256  0Ω/DNP  [0603R]
R257  30M  [0603R]
R258  0Ω/DNP  [0603R]
R259  30M  [0603R]
R260  510R  [0603R]
R261  0Ω/DNP  [0603R]
R262  30M  [0603R]
R263  0Ω/DNP  [0603R]
R264  30M  [0603R]
R265  0Ω/DNP  [0603R]
R266  30M  [0603R]
R267  0Ω/DNP  [0603R]
R268  30M  [0603R]
Rg1  5.49K  [0603R]
Rg2  5.49K  [0603R]
Rg3  5.49K  [0603R]
Rg4  5.49K  [0603R]
Rg5  5.49K  [0603R]
Rg6  5.49K  [0603R]
Rg7  5.49K  [0603R]
Rg8  5.49K  [0603R]
SW1  SW-1P  [CSW DIP-1P]  (value not drawn)
SW2  2MS1T2B2VS2QES  [SW-TH_2MS1T2B2VS2QES]
SW3  DSWB02LHGET  [CSW DIP-2P]
SW4  SW_PB_ESW  [TSW SMD-6*6*4.3]
T1  TEST POINT  [TEST]  (value not drawn)
U1  TPS7A4701  [PCBComponent_1]
U2  TPS7A3301  [PCBComponent_1]
U3  TP6327GS6  [SOT-23-6]
U4  TP6327GS6  [SOT-23-6]
U5  TP6327GS6  [SOT-23-6]
U6  ref2030aiddcr  [SOT-23-5_L2.9-W1.6-P0.95-LS2.8-BL]  (value not drawn)
U7  opa192idbvr  [SOT-23-5_L3.0-W1.7-P0.95-LS2.8-BL]  (value not drawn)
U8  URA2412S-6WR3  [PWRM-TH_URAXXXXS-6WR3]
U9  pc817x2csp9f  [SMD-4_L4.6-W6.5-P2.54-LS10.2-TL]  (value not drawn)
U10  lp5907mfx-3.3/nopb  [SOT-23-5_L3.0-W1.7-P0.95-LS2.8-BR]  (value not drawn)
U11  AMS1117-3.3_C6186  [SOT-223-3_L6.5-W3.4-P2.30-LS7.0-BR]  (value not drawn)
U12  adau1979wbcpz-rl  [QFN-40_L6.0-W6.0-P0.50-TL-EP4.1]  (value not drawn)
U13  ura2415ymd-15wr3  [PWRM-TH_URA2415YMD-15WR3]  (value not drawn)
U14  TJA1057GT3_8P  [SOIC-8]
U15  VP811  [SOT-143]
U16  RTL8211E-VB  [QFN-48_L6.0-W6.0-P0.40-BL-EP3.8]
U17  adau1979wbcpz-rl  [QFN-40_L6.0-W6.0-P0.50-TL-EP4.1]  (value not drawn)
U18  MAX3485  [SOIC-8]
U19  ISO7221AD  [SOIC-8]
U20  CH340C  [SOP-16]
U21  LT1167  [SO-8]
U22  LT1167  [SO-8]
U23  LT1167  [SO-8]
U24  LT1167  [SO-8]
U25  LT1167  [SO-8]
U26  LT1167  [SO-8]
U27  LT1167  [SO-8]
U28  LT1167  [SO-8]
U29  LT1793  [SOP-8]
U30  LT1793  [SOP-8]
U31  LT1793  [SOP-8]
U32  LT1793  [SOP-8]
U33  LT1793  [SOP-8]
U34  LT1793  [SOP-8]
U35  LT1793  [SOP-8]
U36  LT1793  [SOP-8]
U37  dg201BDY  [dg201BDY]
U38  dg201BDY  [dg201BDY]
U39  dg201BDY  [dg201BDY]
U40  dg201BDY  [dg201BDY]
U41  dg201BDY  [dg201BDY]
U42  dg201BDY  [dg201BDY]
U43  dg201BDY  [dg201BDY]
U44  dg201BDY  [dg201BDY]
USBC1  TYPE-C-31-M-12  [USB-C_SMD-TYPE-C-31-M-12_1]  (value not drawn)
Y1  25MHz  [SMD3225-4P]

### Nets
1V8: C26.2 C27.2 C29.1 C105.2 C106.2 L3.2 R15.1 R60.2 R61.2 R62.2 R63.2 R86.2 U16.15(DVDD33_1) U16.21(DVDD33_2)
5V_USB: C113.2 C129.1 C130.1 U19.8(VCC2) U20.16(VCC) USBC1.A4B9(VBUS) USBC1.B4A9(VBUS)
+5: C11.2 C12.2 C13.1 C35.2 C36.2 C38.2 C75.2 J6.1 L1.2 R9.1 R27.1 R77.2 U7.5(V+) U10.1(IN) U10.3(EN) U14.3(VCC)
+12V: C2.1 C180.2 C182.2 C184.2 C186.2 C188.2 C190.2 C192.2 C194.2 C196.2 C198.2 C200.2 C202.2 C204.2 C206.2 C208.2 C210.2 R2.2 U1.1(OUT) U1.20(OUT) U29.7(+VS) U30.7(+VS) U31.7(+VS) U32.7(+VS) U33.7(+VS) U34.7(+VS) U35.7(+VS) U36.7(+VS) U37.13(V+) U38.13(V+) U39.13(V+) U40.13(V+) U41.13(V+) U42.13(V+) U43.13(V+) U44.13(V+)
+12V_d: +1.1 C9.2 C10.2 C14.1(A) C15.1(A) C16.2 C17.2 C20.2 C21.2 C22.2 C23.2 C37.2 C47.1(VCC) C48.1 D1.2 F1.2 J4.1 J4.2 J4.3 J4.4 J4.5 J4.6 J4.7 J4.8 U3.3(VIN) U3.5(EN) U4.3(VIN) U4.5(EN) U5.3(VIN) U5.5(EN) U8.6(+Vo)
+15V: +2.1 C1.1 C67.2 C70.1 C146.1 C149.1 C150.1 C151.1 C152.1 C153.1 C154.1 C155.1 J10.17 L9.2 U1.13(EN) U1.15(IN) U1.16(IN) U21.7(+VS) U22.7(+VS) U23.7(+VS) U24.7(+VS) U25.7(+VS) U26.7(+VS) U27.7(+VS) U28.7(+VS)
-12V: C4.1 C5.1 C181.2 C183.2 C185.2 C187.2 C189.2 C191.2 C193.2 C195.2 C197.2 C199.2 C201.2 C203.2 C205.2 C207.2 C209.2 C211.2 R5.2 U2.1(OUT) U2.20(OUT) U29.4(-VS) U30.4(-VS) U31.4(-VS) U32.4(-VS) U33.4(-VS) U34.4(-VS) U35.4(-VS) U36.4(-VS) U37.4(V-) U38.4(V-) U39.4(V-) U40.4(V-) U41.4(V-) U42.4(V-) U43.4(V-) U44.4(V-)
-15V: -3.1 C6.1 C62.1 C63.2 C156.2 C158.2 C161.2 C163.2 C165.2 C167.2 C169.2 C171.2 J10.19 L7.2 U2.13(EN) U2.15(IN) U2.16(IN) U21.4(-VS) U22.4(-VS) U23.4(-VS) U24.4(-VS) U25.4(-VS) U26.4(-VS) U27.4(-VS) U28.4(-VS)
ADVDD10_PS: C84.2 C85.2 C86.2 R56.1 U16.3(AVDD10_1) U16.9(AVDD10_2) U16.40(AVDD10_3)
AGND: C1.2 C2.2 C3.2 C5.2 C6.2 C7.2 C52.2(GND) C53.1 C60.1 C61.2 C62.2 C63.1 C65.2 C66.1 C67.1 C68.1 C69.2 C70.2 C71.2 C72.1 C78.2 C81.1 C82.1 C87.2 C88.2(GND) C100.2 C112.2 C119.2 C120.2 C121.1 C126.2 C131.2(GND) C139.2 C140.2 C141.2 C142.2 C143.2 C144.2 C145.2 C146.2 C147.2 C148.2 C149.2 C150.2 C151.2 C152.2 C153.2 C154.2 C155.2 C156.1 C157.1 C158.1 C159.1 C160.1 C161.1 C162.1 C163.1 C164.1 C165.1 C166.1 C167.1 C168.1 C169.1 C170.1 C171.1 C180.1 C181.1 C182.1 C183.1 C184.1 C185.1 C186.1 C187.1 C188.1 C189.1 C192.1 C193.1 C194.1 C195.1 C196.1 C197.1 C198.1 C199.1 C200.1 C201.1 C202.1 C203.1 C204.1 C205.1 C206.1 C207.1 C208.1 C209.1 C210.1 C211.1 J10.18 J10.20 J10.23 J10.24 L6.1 OSC1.2(GND) R4.1 R6.1 R28.1 R29.1 R34.1 R35.1 R48.1 R50.1 R53.2 R54.1 R58.1 R59.1 R70.1 R71.1 R80.1 R85.1 R98.1 R100.1 R102.2 R103.1 R108.1 R109.1 R133.1 R134.2 R136.1 R137.1 R138.2 R140.2 R142.1 R143.1 R144.1 R145.2 R146.1 R147.2 R149.2 R153.2 R155.1 R156.2 R218.1 R228.1 R230.1 R232.1 R235.1 R236.1 R237.1 R243.1 R248.1 R254.1 R256.1 R258.1 R261.1 R263.1 R265.1 R267.1 U1.7(GND) U2.7(GND) U12.1(AGND1) U12.5(AGND2) U12.9(SA_MODE) U12.21(AGND3) U12.22(AGND4) U12.28(AGND5) U12.29(AGND6) U12.41(EPAD) U13.2(GND) U13.5(0V) U17.1(AGND1) U17.5(AGND2) U17.9(SA_MODE) U17.28(AGND5) U17.29(AGND6) U17.41(EPAD) U37.5(GND) U38.5(GND) U39.5(GND) U40.5(GND) U41.5(GND) U42.5(GND) U43.5(GND) U44.5(GND)
AVDD: C33.2 C34.2 C40.1(VCC) C41.2 C66.2 C81.2 C82.2 C99.2 C100.1 C112.1 C120.1 C121.2 C136.2 C139.1 L5.2 R68.2 R119.2 T1.1 U6.3(EN) U6.4(VIN) U12.4(AVDD2) U12.31(AVDD3) U12.40(AVDD1) U17.4(AVDD2) U17.31(AVDD3) U17.40(AVDD1)
DVDD10_PS: C91.2 C92.2 C93.2 C94.2 L10.2 R56.2 U16.28(DVDD10_1) U16.36(DVDD10_2)
GND: C9.1 C10.1 C11.1 C12.1 C14.2(K) C15.2(K) C16.1 C17.1 C20.1 C21.1 C22.1 C23.1 C24.1 C25.1 C26.1 C27.1 C30.2 C31.1 C32.1 C33.1 C34.1 C35.1 C36.1 C38.1 C39.1 C40.2(GND) C41.1 C42.1 C43.2(GND) C44.2(GND) C45.2 C46.2 C47.2(GND) C48.2 C49.1(VCC) C50.2 C54.2(GND) C55.2 C56.2(GND) C57.2 C75.1 C77.1 C84.1 C85.1 C86.1 C89.1 C90.1 C91.1 C92.1 C93.1 C94.1 C96.1 C102.1 C103.1 C104.1 C105.1 C106.1 C110.1 C111.1 C113.1 C116.2 C118.1 C125.1 C127.1 C128.1 C129.2 C130.2 C132.1 C133.1 C135.1 D1.1 D3.2(A) J1.1 J1.2 J1.15 J1.20 J1.37 J1.38 J1.43 J1.49 J1.56 J1.59 J1.60 J2.1 J2.2 J2.12 J2.15 J2.18 J2.24 J2.25 J2.30 J2.35 J2.40 J2.45 J2.50 J2.59 J2.60 J3.1 J3.2 J3.12 J3.15 J3.16 J3.20 J3.21 J3.24 J3.30 J3.31 J3.36 J3.37 J3.42 J3.43 J3.48 J3.49 J3.54 J3.59 J3.60 J4.9 J4.10 J4.11 J4.12 J4.13 J4.14 J4.15 J4.16 J4.32 J4.45 J4.59 J4.60 J5.2 J5.10 J6.2 J7.2 J12.10(CHS) J12.15(SH) J12.16(SH1) JACK1.2(G2) JACK1.3(G3) L6.2 LED1.2(K) P2.1 Q1.2(S) R7.2 R8.2 R10.2 R11.1 R12.2 R17.1 R18.1 R22.1 R25.2 R46.1 R69.1 R74.1 R75.1 R93.1 R95.1 R99.1 R106.2 R110.2 R115.2 R120.2 R121.2 R123.1 SW3.1 SW3.2 SW4.1 SW4.4 U3.1(GND) U4.1(GND) U5.1(GND) U6.2(GND) U7.2(V-) U8.1(GND) U8.7(0V) U10.2(GND) U11.1(GND) U12.11(DGND) U14.2(GND) U14.8(S) U15.1(GND) U16.47(GND) U16.49(EGND) U17.11(DGND) U18.5(GND) U19.4(GND1) U19.5(GND2) U20.1(GND) USBC1.A1B12(GND) USBC1.B1A12(GND) Y1.2(GND1) Y1.4(GND2)
IOVDD: -2.1 C24.2 C25.2 C28.1 C52.1(VCC) C53.2 C54.1(VCC) C55.1 C77.2 C78.1 C89.2 C102.2 C103.2 C104.2 C110.2 C111.2 C116.1 C118.2 C119.1 J5.4 J7.1 J12.14(YELA) L2.2 OSC1.4(VDD) R1.1 R13.2 R14.1 R19.1 R23.1 R24.1 R26.2 R36.1 R37.1 R40.1 R41.1 R45.2 R66.2 R78.1 R79.1 R81.1 R82.1 R83.2 R90.2 R96.2 R111.2 R114.2 R116.2 R117.2 R118.2 R124.2 U11.2(VOUT) U11.4(VOUT) U12.12(IO_VDD) U14.5(VIO) U15.4(VDD) U16.6(AVDD33_1) U16.37(DVDD33_3) U16.38(ENSWREG) U16.41(AVDD33_2) U16.44(VDDREG1) U16.45(VDDREG2) U17.12(IO_VDD) U18.8(VCC) U19.1(VCC1)  [also labelled 3V3]
VBIAS_1V5: R31.1 R38.1 R51.1 R64.1 R72.1 R87.1 R104.1 R112.1 R135.1 R139.1 R141.1 R148.1 R150.1 R151.1 R152.1 R154.1 R193.2 R204.2 R205.2 R208.1 R211.2 R212.2 R213.2 R221.2 R249.1 R255.1 R257.1 R259.1 R262.1 R264.1 R266.1 R268.1 U7.1(OUT) U7.4(IN-)
VBIAS_1V5_RAW: C31.2 C32.2 U6.1(VBIAS) U7.3(IN+)
24V: C43.1(VCC) C44.1(VCC) C45.1 C46.1 D3.1(C) F2.2 L4.1 L8.1 R25.1  [also labelled 24V_1, 24V_2]
485_DE: J4.24 JP1.4 R118.1  [also labelled A9, PS_MIO43]
485_RXD: J4.28 JP1.6 R124.1  [also labelled B15, PS_MIO45]
485_TXD: J4.26 JP1.2 R111.1  [also labelled F13, PS_MIO44]
485DE: JP1.3 R99.2 U18.2(~{RE}) U18.3(DE)
485RXD: JP1.5 U18.1(RXD)
485TXD: JP1.1 U18.4(TXD)
-12V_d: -1.1 C42.2 C49.2(GND) C50.1 U8.8(-Vo)
A6: J3.17 R24.2 SW3.3  [also labelled BOOT_MIO5]
A10: J4.52  [also labelled PS_MIO37]
A11: J4.50  [also labelled PS_MIO36]
A12: J4.46  [also labelled PS_MIO34]
A14: J4.42  [also labelled PS_MIO32]
A15: J4.55 R63.1 U16.18(RXD3/AN1)  [also labelled PS_ETH_RXD3]
A16: J4.51 R61.1 U16.16(RXD1/TXDLY)  [also labelled PS_ETH_RXD1]
A17: J4.41 U16.26(TXD3)  [also labelled PS_ETH_TXD3]
A19: J4.33 U16.22(TXC)  [also labelled PS_ETH_TX_CLK]
A20: J2.52  [also labelled IO35_L2N]
ADC_PD_RST_N: R1.2 R3.2 R66.1 R117.1 U12.6(#PD/#RST) U17.6(#PD/#RST)
ADIN1: 15.1 R260.1 R267.2 R268.2 U27.6(OUT)
ADIN2: 16.1 R251.1 R261.2 R262.2 U28.6(OUT)
ADIN3: 13.1 R252.1 R263.2 R264.2 U26.6(OUT)
ADIN4: 14.1 R253.1 R265.2 R266.2 U25.6(OUT)
ADIN5: 9.1 R246.1 R254.2 R255.2 U21.6(OUT)
ADIN6: 10.1 R244.1 R248.2 R249.2 U22.6(OUT)
ADIN7: 11.1 R247.1 R256.2 R257.2 U23.6(OUT)
ADIN8: 12.1 R250.1 R258.2 R259.2 U24.6(OUT)
AIN1_N: C59.2 R29.2 R32.2 U12.32(#AIN1)
AIN1_P: C59.1 R33.2 U12.33(AIN1)
AIN2_N: C74.2 R35.2 R39.2 U12.34(#AIN2)
AIN2_P: C74.1 R43.2 U12.35(AIN2)
AIN3_N: C80.2 R50.2 R52.2 U12.36(#AIN3)
AIN3_P: C80.1 R55.2 U12.37(AIN3)
AIN4_N: C98.2 R59.2 R65.2 U12.38(#AIN4)
AIN4_P: C98.1 R67.2 U12.39(AIN4)
AIN5_N: C108.2 R71.2 R73.2 U17.32(#AIN1)
AIN5_P: C108.1 R76.2 U17.33(AIN1)
AIN6_N: C115.2 R85.2 R88.2 U17.34(#AIN2)
AIN6_P: C115.1 R92.2 U17.35(AIN2)
AIN7_N: C123.2 R100.2 R105.2 U17.36(#AIN3)
AIN7_P: C123.1 R107.2 U17.37(AIN3)
AIN8_N: C138.2 R109.2 R113.2 U17.38(#AIN4)
AIN8_P: C138.1 R122.2 U17.39(AIN4)
B5: J4.23 J8.2  [also labelled CAN_TX]
B7: J3.19 R23.2 SW3.4  [also labelled BOOT_MIO4]
B17: J4.47 R74.2 U16.19(RXCLK)  [also labelled PS_ETH_RX_CLK]
B18: J4.37 U16.24(TXD1)  [also labelled PS_ETH_TXD1]
B19: J2.54  [also labelled IO35_L2P]
B20: J2.56  [also labelled IO35_L1N]
BCLK: J2.39 R42.2 R89.2  [also labelled K17]
C01: JP9.2 R171.2 R172.1 U41.15(D2)
C02: JP18.2 R189.2 R190.1 U41.10(D3)
C03: JP26.2 R209.2 R210.1 U41.2(D1)
C04: JP33.2 R233.2 R234.1 U41.7(D4)
C5: J4.29 J11.4 R90.1  [also labelled UART_RX]
C6: J4.27
c7: J3.18 U15.2(~{RESE}T) U16.29(PHYRSTB)  [also labelled PS_POR_B]
C8: J4.31 J11.2 R83.1  [also labelled UART_TX]
C10: J2.4 U16.30(MDC)  [also labelled PS_ETH_MDC]
C11: JP7.2 R165.2 R166.1 U38.15(D2)
C11_!: J2.6 R86.1 U16.31(MDIO)  [also labelled PS_ETH_MDIO]
C12: JP14.2 R181.2 R182.1 U38.10(D3)
C13: JP22.2 R198.2 R199.1 U38.2(D1)
C13_1: J4.36  [also labelled PS_MIO29]
C14: JP30.2 R222.2 R223.1 U38.7(D4)
C15_1: J4.38  [also labelled PS_MIO30]
C16_1: J4.34  [also labelled PS_MIO28]
C17_!: J4.20  [also labelled PS_MIO41]
C18: J4.56  [also labelled PS_MIO39]
C20: J2.58  [also labelled IO35_L1P]
C21: JP6.2 R167.2 R168.1 U37.15(D2)
C22: JP15.2 R183.2 R184.1 U37.10(D3)
C23: JP23.2 R200.2 R201.1 U37.2(D1)
C24: JP31.2 R224.2 R225.1 U37.7(D4)
C31: JP8.2 R169.2 R170.1 U39.15(D2)
C32: JP16.2 R185.2 R186.1 U39.10(D3)
C33: JP24.2 R202.2 R203.1 U39.2(D1)
C34: JP32.2 R226.2 R227.1 U39.7(D4)
C41: JP3.2 R159.2 R160.1 U42.15(D2)
C42: JP11.2 R175.2 R176.1 U42.10(D3)
C43: JP19.2 R191.2 R192.1 U42.2(D1)
C44: JP27.2 R214.2 R215.1 U42.7(D4)
C51: JP2.2 R157.2 R158.1 U43.15(D2)
C52: JP10.2 R173.2 R174.1 U43.10(D3)
C53: JP17.2 R187.2 R188.1 U43.2(D1)
C54: JP25.2 R206.2 R207.1 U43.7(D4)
C61: JP4.2 R161.2 R162.1 U44.15(D2)
C62: JP12.2 R177.2 R178.1 U44.10(D3)
C63: JP20.2 R194.2 R195.1 U44.2(D1)
C64: JP28.2 R216.2 R217.1 U44.7(D4)
C71: JP5.2 R163.2 R164.1 U40.15(D2)
C72: JP13.2 R179.2 R180.1 U40.10(D3)
C73: JP21.2 R196.2 R197.1 U40.2(D1)
C74: JP29.2 R219.2 R220.1 U40.7(D4)
CAN_N: J9.3 R57.2 U14.6(CANL)
CAN_P: J9.1 R57.1 U14.7(CANH)
CAN_RX: J4.21 J8.4  [also labelled D5]
CAN_RX1: J8.3 U14.4(RXD)
CAN_TX1: J8.1 U14.1(TXD)
CS0: C179.2 JP9.1 JP18.1 JP26.1 JP33.1 R245.2 U41.3(S1) U41.6(S4) U41.11(S3) U41.14(S2)
CS1: C176.2 JP7.1 JP14.1 JP22.1 JP30.1 R240.2 U38.3(S1) U38.6(S4) U38.11(S3) U38.14(S2)
CS2: C177.2 JP6.1 JP15.1 JP23.1 JP31.1 R241.2 U37.3(S1) U37.6(S4) U37.11(S3) U37.14(S2)
CS3: C178.2 JP8.1 JP16.1 JP24.1 JP32.1 R242.2 U39.3(S1) U39.6(S4) U39.11(S3) U39.14(S2)
CS4: C173.2 JP3.1 JP11.1 JP19.1 JP27.1 R231.2 U42.3(S1) U42.6(S4) U42.11(S3) U42.14(S2)
CS5: C172.2 JP2.1 JP10.1 JP17.1 JP25.1 R229.2 U43.3(S1) U43.6(S4) U43.11(S3) U43.14(S2)
CS6: C174.2 JP4.1 JP12.1 JP20.1 JP28.1 R238.2 U44.3(S1) U44.6(S4) U44.11(S3) U44.14(S2)
CS7: C175.2 JP5.1 JP13.1 JP21.1 JP29.1 R239.2 U40.3(S1) U40.6(S4) U40.11(S3) U40.14(S2)
CTP_INT: J1.13  [also labelled P19]
CTP_RST: J1.11  [also labelled R19]
D8: J4.19  [also labelled PS_LED2]
D9: J4.30  [also labelled PS_MIO12]
D10: J4.39 U16.25(TXD2)  [also labelled PS_ETH_TXD2]
D11: J4.49 R60.1 U16.14(RXD0/SELRGV)  [also labelled PS_ETH_RXD0]
D13: J4.57 R75.2 U16.13(RXCTL/PHY_AD2)  [also labelled PS_ETH_RX_CTL]
D14: J4.18  [also labelled PS_MIO40]
D15: J4.44  [also labelled PS_MIO33]
D18: J2.46  [also labelled IO35_L3N]
D19: J2.44  [also labelled IO35_L4P]
D20: J2.42  [also labelled IO35_L4N]
E6: J4.17  [also labelled PS_LED1]
E8: J4.58  [also labelled PS_MIO13]
E9: J4.25
E12: J4.22  [also labelled PS_MIO42]
E13: J4.54  [also labelled PS_MIO38]
E14: J4.35 U16.23(TXD0)  [also labelled PS_ETH_TXD0]
E16: J4.40  [also labelled PS_MIO31]
E17: J2.48  [also labelled IO35_L3P]
E18: J2.38  [also labelled IO35_L5P]
E19: J2.36  [also labelled IO35_L5N]
eHRPWM0A: J3.3 R21.1  [also labelled P20]
F6: J3.6 J5.3  [also labelled FPGA_TDO]
F9: J3.4 J5.1  [also labelled FPGA_TCK]
F12: J4.48  [also labelled PS_MIO35]
F14: J4.43 U16.27(TXCTL)  [also labelled PS_ETH_TX_CTL]
F15: J4.53 R62.1 U16.17(RXD2/AN0)  [also labelled PS_ETH_RXD2]
F16: J2.34
F17: J2.32
F19: J2.33
F20: J2.31 R47.2  [also labelled SDATAOUT02]
FPGA_DONE: J3.22 LED2.2(ANODE) R45.1  [also labelled R11]
FPGA_TDI: J3.8 J5.9  [also labelled G6]
FPGA_TMS: J3.10 J5.5  [also labelled J6]
G1: R7.1
G2: R8.1
G3: R10.1
G4: R12.1
G14: J2.8  [also labelled IO35_IO0]
G15: J2.26
G17: J2.29 R49.2  [also labelled SDATAOUT01]
G18: J2.27 R3.1
G19: J2.19
G20: J2.17
GAIN_X1: J2.51 U37.8(IN4) U38.8(IN4) U39.8(IN4) U40.8(IN4) U41.8(IN4) U42.8(IN4) U43.8(IN4) U44.8(IN4)  [also labelled M18]
GAIN_X10: J2.57 U37.1(IN1) U38.1(IN1) U39.1(IN1) U40.1(IN1) U41.1(IN1) U42.1(IN1) U43.1(IN1) U44.1(IN1)  [also labelled M19]
GAIN_X30: J2.53 U37.9(IN3) U38.9(IN3) U39.9(IN3) U40.9(IN3) U41.9(IN3) U42.9(IN3) U43.9(IN3) U44.9(IN3)  [also labelled M17]
GAIN_X99: J2.55 U37.16(IN2) U38.16(IN2) U39.16(IN2) U40.16(IN2) U41.16(IN2) U42.16(IN2) U43.16(IN2) U44.16(IN2)  [also labelled M20]
H15: J2.28
H16: J1.51  [also labelled IO35_L13P]
H17: J1.53  [also labelled IO35_L13N]
H18: J1.57  [also labelled IO35_L14N]
H20: J2.21 R97.2  [also labelled SDATAOUT11]
IO1+: 23.1 C168.2 J10.1 R131.2 R153.1 U27.3(+IN)
IO1-: 6.1 C147.1 J10.2 R131.1 U27.2(-IN)
IO2+: 24.1 C170.2 J10.3 R132.2 R156.1 U28.3(+IN)
IO2-: 8.1 C148.1 J10.4 R132.1 U28.2(-IN)
IO3+: 21.1 C166.2 J10.5 R129.2 R147.1 U26.3(+IN)
IO3-: 4.1 C144.1 J10.6 R129.1 U26.2(-IN)
IO4+: 22.1 C164.2 J10.7 R130.2 R149.1 U25.3(+IN)
IO4-: 5.1 C145.1 J10.8 R130.1 U25.2(-IN)
IO5+: 17.1 C157.2 J10.9 R125.2 R134.1 U21.3(+IN)
IO5-: 1.1 C140.1 J10.10 R125.1 U21.2(-IN)
IO6+: 18.1 C159.2 J10.11 R126.2 R138.1 U22.3(+IN)
IO6-: 2.1 C141.1 J10.12 R126.1 U22.2(-IN)
IO7+: 19.1 C160.2 J10.13 R127.2 R140.1 U23.3(+IN)
IO7-: 7.1 C142.1 J10.14 R127.1 U23.2(-IN)
IO8+: 20.1 C162.2 J10.15 R128.2 R145.1 U24.3(+IN)
IO8-: 3.1 C143.1 J10.16 R128.1 U24.2(-IN)
IO13_L6N: J3.14  [also labelled v5]
IO13_L11N: J3.56  [also labelled V7]
IO13_L11P: J3.58  [also labelled U7]
IO13_L12N: J3.50  [also labelled U10]
IO13_L12P: J3.52  [also labelled T9]
IO13_L13N: J3.44  [also labelled Y6]
IO13_L13P: J3.46  [also labelled Y7]
IO13_L14N: J3.38  [also labelled Y8]
IO13_L14P: J3.40  [also labelled Y9]
IO13_L15N: J3.32  [also labelled W8]
IO13_L15P: J3.34  [also labelled V8]
IO13_L16N: J3.55  [also labelled W9]
IO13_L16P: J3.57  [also labelled W10]
IO13_L17N: J3.51  [also labelled U8]
IO13_L17P: J3.53  [also labelled U9]
IO13_L18N: J3.45  [also labelled Y11]
IO13_L18P: J3.47  [also labelled W11]
IO13_L19N: J3.39  [also labelled U5]
IO13_L19P: J3.41  [also labelled T5]
IO13_L20N: J3.33  [also labelled Y13]
IO13_L20P: J3.35  [also labelled Y12]
IO13_L21N: J3.27  [also labelled V10]
IO13_L21P: J3.29  [also labelled V11]
IO13_L22N: J3.23  [also labelled W6]
IO13_L22P: J3.25  [also labelled V6]
IO34_25: J1.58  [also labelled T19]
IO34_L7N: J1.23  [also labelled Y17]
IO34_L7P: J1.21  [also labelled Y16]
IO34_L8N: J1.19  [also labelled Y14]
IO34_L8P: J1.17  [also labelled W14]
IO34_L11N: J1.41  [also labelled U15]
IO34_L11P: J1.39  [also labelled U14]
IO35_IO25: J2.10  [also labelled J15]
IO35_L10N: J1.47  [also labelled J19]
IO35_L10P: J1.45  [also labelled K19]
IO35_L14P: J1.55  [also labelled J18]
IO35_L21N: J2.11  [also labelled N16]
IO35_L21P: J2.13  [also labelled N15]
IO35_L22N: J2.7  [also labelled L15]
IO35_L22P: J2.9  [also labelled L14]
IO35_L23N: J2.3
IO35_L23P: J2.5  [also labelled M14]
J14: J2.20
J16: J2.14
J20: J2.23 R94.2  [also labelled SDATAOUT12]
K9: J3.28  [also labelled XADC_VP]
K14: J2.22
K16: J2.16
K18: J2.37 R44.2 R91.2  [also labelled LRCLK]
L10: J3.26  [also labelled XADC_VN]
L16: J2.43 R40.2 R81.2 U12.18(SCL/CCLK) U17.18(SCL/CCLK)  [also labelled SCL]
L17: J2.41 R41.2 R82.2 U12.17(SDA/COUT) U17.17(SDA/COUT)  [also labelled SDA]
L19: J2.49
L20: J2.47
LCD_B0: J1.40  [also labelled V16]
LCD_B1: J1.42  [also labelled W16]
LCD_B2: J1.48  [also labelled W18]
LCD_B3: J1.50  [also labelled W19]
LCD_B4: J1.52  [also labelled U18]
LCD_B5: J1.54  [also labelled U19]
LCD_B6: J1.44  [also labelled R16]
LCD_B7: J1.46  [also labelled R17]
LCD_DE: J1.7  [also labelled V15]
LCD_G0: J1.22  [also labelled V17]
LCD_G1: J1.24  [also labelled V18]
LCD_G2: J1.26  [also labelled T16]
LCD_G3: J1.28  [also labelled U17]
LCD_G4: J1.30  [also labelled P15]
LCD_G5: J1.32  [also labelled P16]
LCD_G6: J1.34  [also labelled P14]
LCD_G7: J1.36  [also labelled R14]
LCD_HSYNC: J1.3  [also labelled V12]
LCD_PCLK: J1.9  [also labelled W15]
LCD_R0: J1.4  [also labelled T11]
LCD_R1: J1.6  [also labelled T10]
LCD_R2: J1.8  [also labelled T12]
LCD_R3: J1.10  [also labelled U12]
LCD_R4: J1.12  [also labelled U13]
LCD_R5: J1.14  [also labelled V13]
LCD_R6: J1.16  [also labelled T14]
LCD_R7: J1.18  [also labelled T15]
LCD_VSYNC: J1.5  [also labelled W13]
MCLK: R30.2 U12.7(MCLKIN) U17.7(MCLKIN)
N17: J3.13
N20: J3.5
OUT1_P: C58.1 R172.2 R190.2 R210.2 R234.2 U36.6(OUT)
OUT2_P: C73.2 R166.2 R182.2 R199.2 R223.2 U33.6(OUT)
OUT3_P: C79.2 R168.2 R184.2 R201.2 R225.2 U34.6(OUT)
OUT4_P: C97.2 R170.2 R186.2 R203.2 R227.2 U35.6(OUT)
OUT5_P: C107.2 R160.2 R176.2 R192.2 R215.2 U30.6(OUT)
OUT6_P: C114.2 R158.2 R174.2 R188.2 R207.2 U29.6(OUT)
OUT7_P: C122.2 R162.2 R178.2 R195.2 R217.2 U31.6(OUT)
OUT8_P: C137.2 R164.2 R180.2 R197.2 R220.2 U32.6(OUT)
P18: J3.11
PS_ETH_LED0: R101.1 R116.1 U16.34(LED0/PHY_AD0)
PS_ETH_LED1: J12.11(GRLA) R115.1 U16.35(LED1/PHY_AD1)
PS_N0: J12.3(TD1-) U16.2(MDI[0]-)
PS_N1: J12.7(RD1-) U16.5(MDI[1]-)
PS_N2: J12.6(TD2-) U16.8(MDI[2]-)
PS_N3: J12.9(RD2-) U16.11(MDI[3]-)
PS_P0: J12.2(TD1+) U16.1(MDI[0]+)
PS_P1: J12.4(RD1+) U16.4(MDI[1]+)
PS_P2: J12.5(TD2+) U16.7(MDI[2]+)
PS_P3: J12.8(RD2+) U16.10(MDI[3]+)
PULSE_24V_GND: D2.2(A) P1.1 U9.3
PULSE_EXT_24V+: P1.3 R16.1
PULSE_OUT: D2.1(C) P1.2 R20.2 U9.4
R18: J3.7
RXD: U19.7(OUTA) U20.3(RXD)
RXD_1: J11.1 U19.2(INA)
T17: J3.9
T20: J1.33
TXD: U19.6(INB) U20.2(TXD)
TXD_1: J11.3 U19.3(OUTB)
U20: J1.35
V20: J1.29
W20: J1.31
Y18: J1.25
Y19: J1.27
NetC3_1: C3.1 U1.14(NR)
NetC4_2: C4.2 R5.1 R6.2 U2.3(FB)
NetC7_1: C7.1 U2.14(NR/SS)
NetC8_1: C8.1 L1.1 U3.2(SW)
NetC8_2: C8.2 U3.6(BOOT)
NetC13_2: C13.2 R9.2 R11.2 U3.4(FB)
NetC18_1: C18.1 L2.1 U4.2(SW)
NetC18_2: C18.2 U4.6(BOOT)
NetC19_1: C19.1 L3.1 U5.2(SW)
NetC19_2: C19.2 U5.6(BOOT)
NetC28_2: C28.2 R14.2 R17.2 U4.4(FB)
NetC29_2: C29.2 R15.2 R18.2 U5.4(FB)
NetC30_1: C30.1 U6.5(VREF)
NetC37_1: C37.1 L4.2 U8.2(VIN)
NetC39_2: C39.2 L5.1 U10.5(OUT)
NetC51_1: C51.1 R31.2 R32.1
NetC51_2: C51.2 R28.2
NetC56_1: C56.1(VCC) C57.1 R27.2 U11.3(VIN)
NetC58_2: C58.2 R33.1
NetC60_2: C60.2 C61.1 L7.1 U13.6(-VO)
NetC64_1: C64.1 R38.2 R39.1
NetC64_2: C64.2 R34.2
NetC65_1: C65.1 C68.2 L9.1 U13.4(+VO)
NetC69_1: C69.1 C71.1 C72.2 L8.2 U13.3(Vin)
NetC73_1: C73.1 R43.1
NetC76_1: C76.1 R51.2 R52.1
NetC76_2: C76.2 R48.2
NetC79_1: C79.1 R55.1
NetC83_1: C83.1 R64.2 R65.1
NetC83_2: C83.2 R58.2
NetC87_1: C87.1 C88.1(VCC) U12.2(VREF)
NetC90_2: C90.2 C96.2 R69.2 U12.10(DVDD)
NetC95_1: C95.1 C99.1 U12.3(PLL_FILT)
NetC95_2: C95.2 R68.1
NetC97_1: C97.1 R67.1
NetC101_1: C101.1 R72.2 R73.1
NetC101_2: C101.2 R70.2
NetC107_1: C107.1 R76.1
NetC109_1: C109.1 R87.2 R88.1
NetC109_2: C109.2 R80.2
NetC114_1: C114.1 R92.1
NetC117_1: C117.1 R104.2 R105.1
NetC117_2: C117.2 R98.2
NetC122_1: C122.1 R107.1
NetC124_1: C124.1 R112.2 R113.1
NetC124_2: C124.2 R108.2
NetC125_2: C125.2 C135.2 R123.2 U17.10(DVDD)
NetC126_1: C126.1 C131.1(VCC) U17.2(VREF)
NetC127_2: C127.2 J12.1(CT)
NetC128_2: C128.2 U20.4(V3)
NetC132_2: C132.2 U16.42(CKXTAL1) Y1.3
NetC133_2: C133.2 U16.43(CKXTAL2) Y1.1
NetC134_1: C134.1 C136.1 U17.3(PLL_FILT)
NetC134_2: C134.2 R119.1
NetC137_1: C137.1 R122.1
NetC172_1: C172.1 R229.1 U29.2(-IN)
NetC173_1: C173.1 R231.1 U30.2(-IN)
NetC174_1: C174.1 R238.1 U31.2(-IN)
NetC175_1: C175.1 R239.1 U32.2(-IN)
NetC176_1: C176.1 R240.1 U33.2(-IN)
NetC177_1: C177.1 R241.1 U34.2(-IN)
NetC178_1: C178.1 R242.1 U35.2(-IN)
NetC179_1: C179.1 R245.1 U36.2(-IN)
NetCON1_1: CON1.1 J13.1 R77.1 U18.6(A)
NetCON1_2: CON1.2 R84.2 R106.1 U18.7(B)
NetF1_1: F1.1 SW1.2
NetF2_1: F2.1 SW2.3
NetJ9_2: J9.2 J10.22
NetJ9_4: J9.4 J10.21
NetJ12_12: J12.12(GRLC) R93.2
NetJ12_13: J12.13(YELC) R101.2
NetJ13_2: J13.2 R84.1
NetJACK1_1: JACK1.1(P) SW1.1
NetL10_1: L10.1 U16.48(REG_OUT)
NetLED1_1: LED1.1(A) R13.1
NetLED2_1: LED2.1(CATHODE) R46.2
NetOSC1_1: OSC1.1(Tri-state) R26.1
NetOSC1_3: OSC1.3(OUT) R30.1
NetP2_2: P2.2 SW2.2
NetQ1_1: Q1.1(G) R21.2 R22.2
NetQ1_3: Q1.3(D) U9.2
NetR2_1: R2.1 R4.2 U1.3(SENSE)
NetR16_2: R16.2 R20.1
NetR19_2: R19.2 U9.1
NetR36_2: R36.2 R53.1 U12.20(ADDR1/CIN)
NetR37_2: R37.2 R54.2 U12.19(ADDR0/CLATCH)
NetR42_1: R42.1 U12.16(BCLK)
NetR44_1: R44.1 U12.15(LRCLK)
NetR47_1: R47.1 U12.14(SDATAOUT2)
NetR49_1: R49.1 U12.13(SDATAOUT1)
NetR78_2: R78.2 R102.1 U17.20(ADDR1/CIN)
NetR79_2: R79.2 R103.2 U17.19(ADDR0/CLATCH)
NetR89_1: R89.1 U17.16(BCLK)
NetR91_1: R91.1 U17.15(LRCLK)
NetR94_1: R94.1 U17.14(SDATAOUT2)
NetR95_2: R95.2 USBC1.1(EH) USBC1.2(EH) USBC1.3(EH) USBC1.4(EH)
NetR96_1: R96.1 U16.20(INTB)
NetR97_1: R97.1 U17.13(SDATAOUT1)
NetR110_1: R110.1 U16.39(RSET)
NetR114_1: R114.1 U16.32(LED2/RXDLY)
NetR120_1: R120.1 USBC1.A5(CC1)
NetR121_1: R121.1 USBC1.B5(CC2)
NetR133_2: R133.2 R135.2 U21.5(REF)
NetR136_2: R136.2 R139.2 U22.5(REF)
NetR137_2: R137.2 R141.2 U23.5(REF)
NetR142_2: R142.2 R150.2 U24.5(REF)
NetR143_2: R143.2 R148.2 U26.5(REF)
NetR144_2: R144.2 R152.2 U25.5(REF)
NetR146_2: R146.2 R154.2 U28.5(REF)
NetR151_2: R151.2 R155.2 U27.5(REF)
NetR157_1: R157.1 R173.1 R187.1 R193.1 R206.1 R218.2
NetR159_1: R159.1 R175.1 R191.1 R204.1 R214.1 R228.2
NetR161_1: R161.1 R177.1 R194.1 R205.1 R216.1 R230.2
NetR163_1: R163.1 R179.1 R196.1 R208.2 R219.1 R232.2
NetR165_1: R165.1 R181.1 R198.1 R211.1 R222.1 R235.2
NetR167_1: R167.1 R183.1 R200.1 R212.1 R224.1 R236.2
NetR169_1: R169.1 R185.1 R202.1 R213.1 R226.1 R237.2
NetR171_1: R171.1 R189.1 R209.1 R221.1 R233.1 R243.2
NetR244_2: R244.2 U29.3(+IN)
NetR246_2: R246.2 U30.3(+IN)
NetR247_2: R247.2 U31.3(+IN)
NetR250_2: R250.2 U32.3(+IN)
NetR251_2: R251.2 U33.3(+IN)
NetR252_2: R252.2 U34.3(+IN)
NetR253_2: R253.2 U35.3(+IN)
NetR260_2: R260.2 U36.3(+IN)
NetRg1_1: Rg1.1 U21.1(-RG)
NetRg1_2: Rg1.2 U21.8(+RG)
NetRg2_1: Rg2.1 U22.1(-RG)
NetRg2_2: Rg2.2 U22.8(+RG)
NetRg3_1: Rg3.1 U23.1(-RG)
NetRg3_2: Rg3.2 U23.8(+RG)
NetRg4_1: Rg4.1 U24.1(-RG)
NetRg4_2: Rg4.2 U24.8(+RG)
NetRg5_1: Rg5.1 U26.1(-RG)
NetRg5_2: Rg5.2 U26.8(+RG)
NetRg6_1: Rg6.1 U25.1(-RG)
NetRg6_2: Rg6.2 U25.8(+RG)
NetRg7_1: Rg7.1 U27.1(-RG)
NetRg7_2: Rg7.2 U27.8(+RG)
NetRg8_1: Rg8.1 U28.1(-RG)
NetRg8_2: Rg8.2 U28.8(+RG)
NetSW4_2: SW4.2 SW4.3 U15.3(~{M}R)
NetU17_21: U17.21(AGND3) U17.22(AGND4)
NetU20_5: U20.5(UD+) USBC1.A6(DP1) USBC1.B6(DP2)
NetU20_6: U20.6(UD-) USBC1.A7(DN1) USBC1.B7(DN2)

Not connected (* = marked no-connect by the designer): C190 1; C191 1; J5 6 7 8; SW2 1 4 5; U1 4(6P4V2) 5(6P4V1) 6(3P2V) 8(1P6V) 9(0P8V) 10(0P4V) 11(0P2V) 12(0P1V); U8 3(CTRL) 5(NC); U10 4(N/C); U12 8(NC) 23(NC) 24(NC) 25(NC) 26(NC) 27(NC) 30(NC); U13 1(Ctrl)*; U16 12(NC) 33(PMEB) 46(CLK125); U17 8(NC) 23(NC) 24(NC) 25(NC) 26(NC) 27(NC) 30(NC); U20 7(NC) 8(~{OU}T) 9(~{CT}S) 10(~{DS}R) 11(~{R}I) 12(~{DC}D) 13(~{DT}R) 14(~{RT}S) 15(RS232); U29 1(VOSADJ) 5(VOSADJ) 8(NC); U30 1(VOSADJ) 5(VOSADJ) 8(NC); U31 1(VOSADJ) 5(VOSADJ) 8(NC); U32 1(VOSADJ) 5(VOSADJ) 8(NC); U33 1(VOSADJ) 5(VOSADJ) 8(NC); U34 1(VOSADJ) 5(VOSADJ) 8(NC); U35 1(VOSADJ) 5(VOSADJ) 8(NC); U36 1(VOSADJ) 5(VOSADJ) 8(NC); U37 12(NC)*; U38 12(NC)*; U39 12(NC)*; U40 12(NC)*; U41 12(NC)*; U42 12(NC)*; U43 12(NC)*; U44 12(NC)*; USBC1 A8(SBU1) B8(SBU2)

### Layout directives
differential pair: AIN1_N, AIN1_P, AIN2_N, AIN2_P, AIN3_N, AIN3_P, AIN4_N, AIN4_P, AIN5_N, AIN5_P, AIN6_N, AIN6_P, AIN7_N, AIN7_P, AIN8_N, AIN8_P

### Notes on the sheet
- (near J1) BTB Connector
- 模拟供电
- (near U3) DC /DC     5V
- (near R7) 定位孔接地
- DC  IN  :  12V
- DC /DC     3.3V
- (near U5) DC /DC     1.8V
- (near SW2) 直流24V电源供电
- BOOT
- 输出脉冲与光耦隔离
- (near L4) 数字12V供电
- ADADU1979
- 下载器
- Text
- TCK  GND
  TDO VCC
  TMS  NC
  NC    NC
  TDI  GND
- 输入端口及CAN
- 配置完成指示灯
- 以太网PS
- 重配置按键
- RS485
- (near J11) USB转串口
- 多路选择
- 一
- +
- 多路开关
- JP为手动跳线，调试专用，默认不装
- Labels drawn without touching a wire or pin: AGND
- (in symbol CE_SMD) +
- (in symbol SW-1P) NO